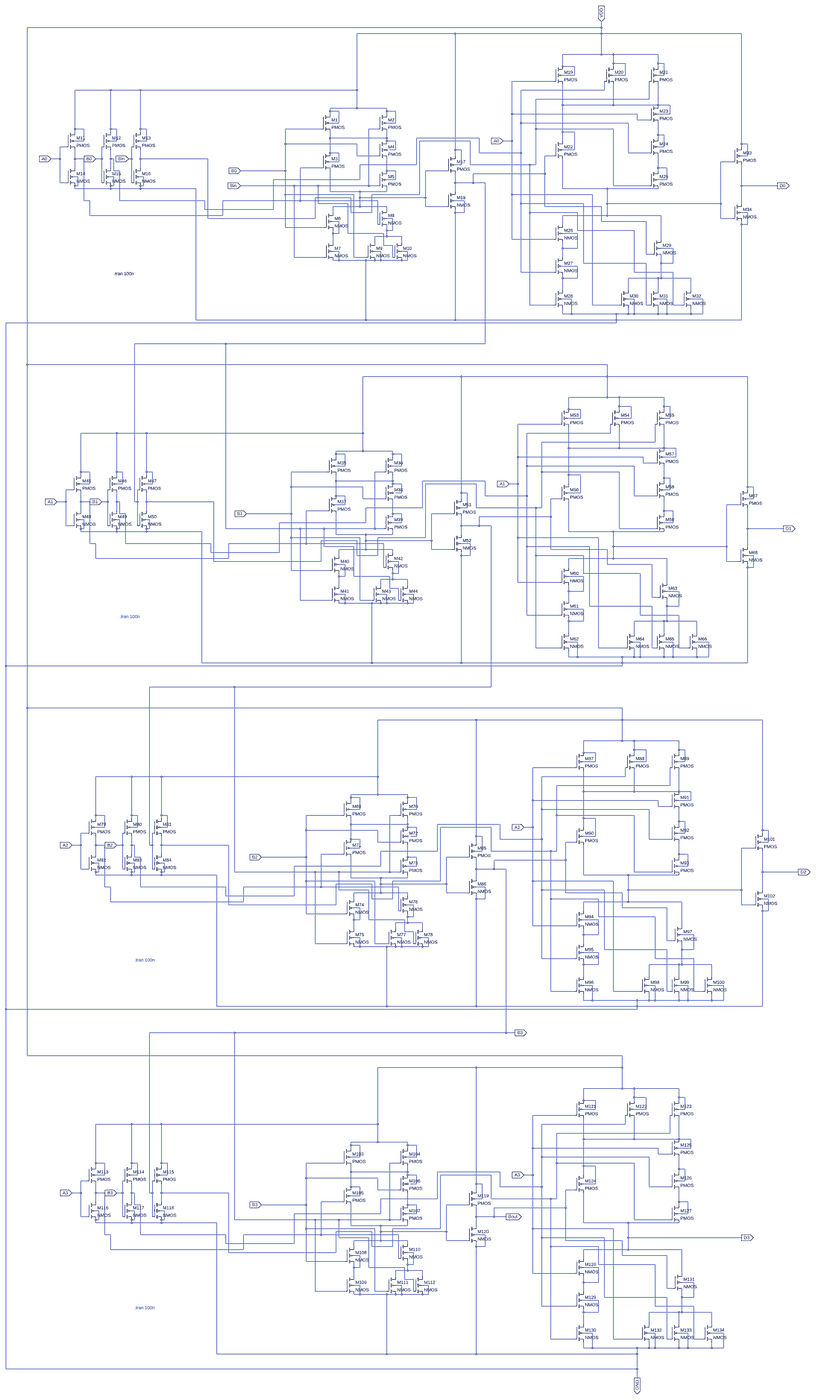
[diagram p0: schematic 4bit_Subtractor.asc, whole sheet]
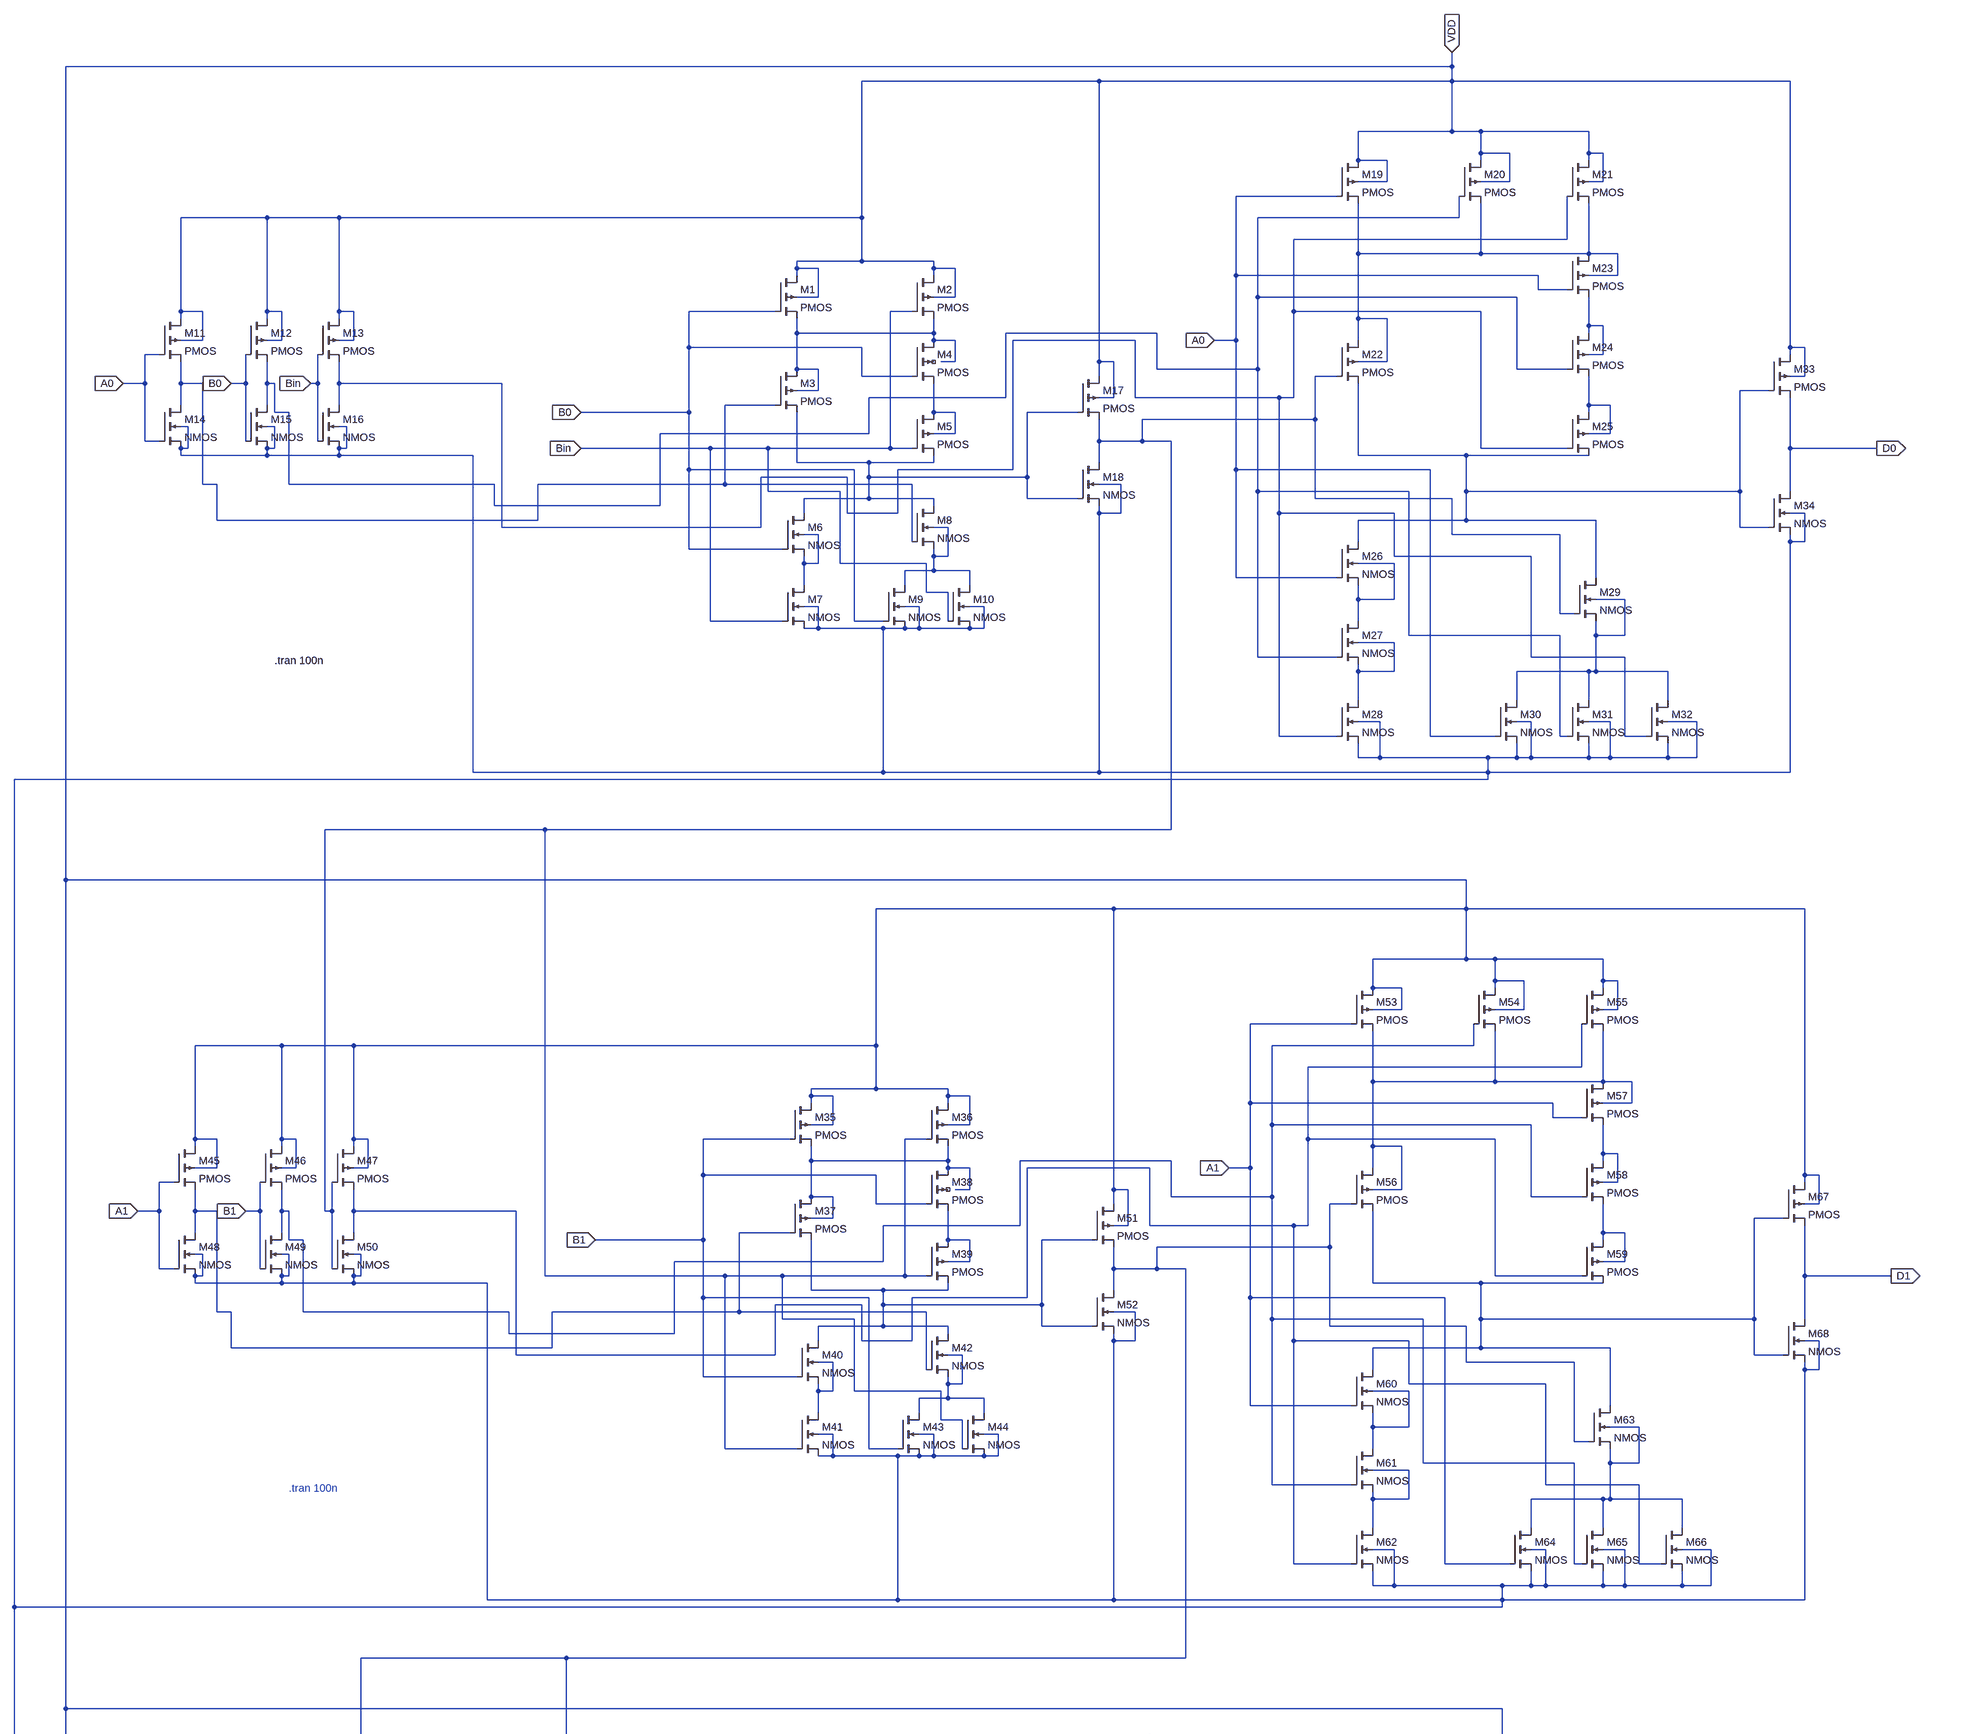
[diagram p1: schematic 4bit_Subtractor.asc, part, row 1 of 2, column 1 of 1]
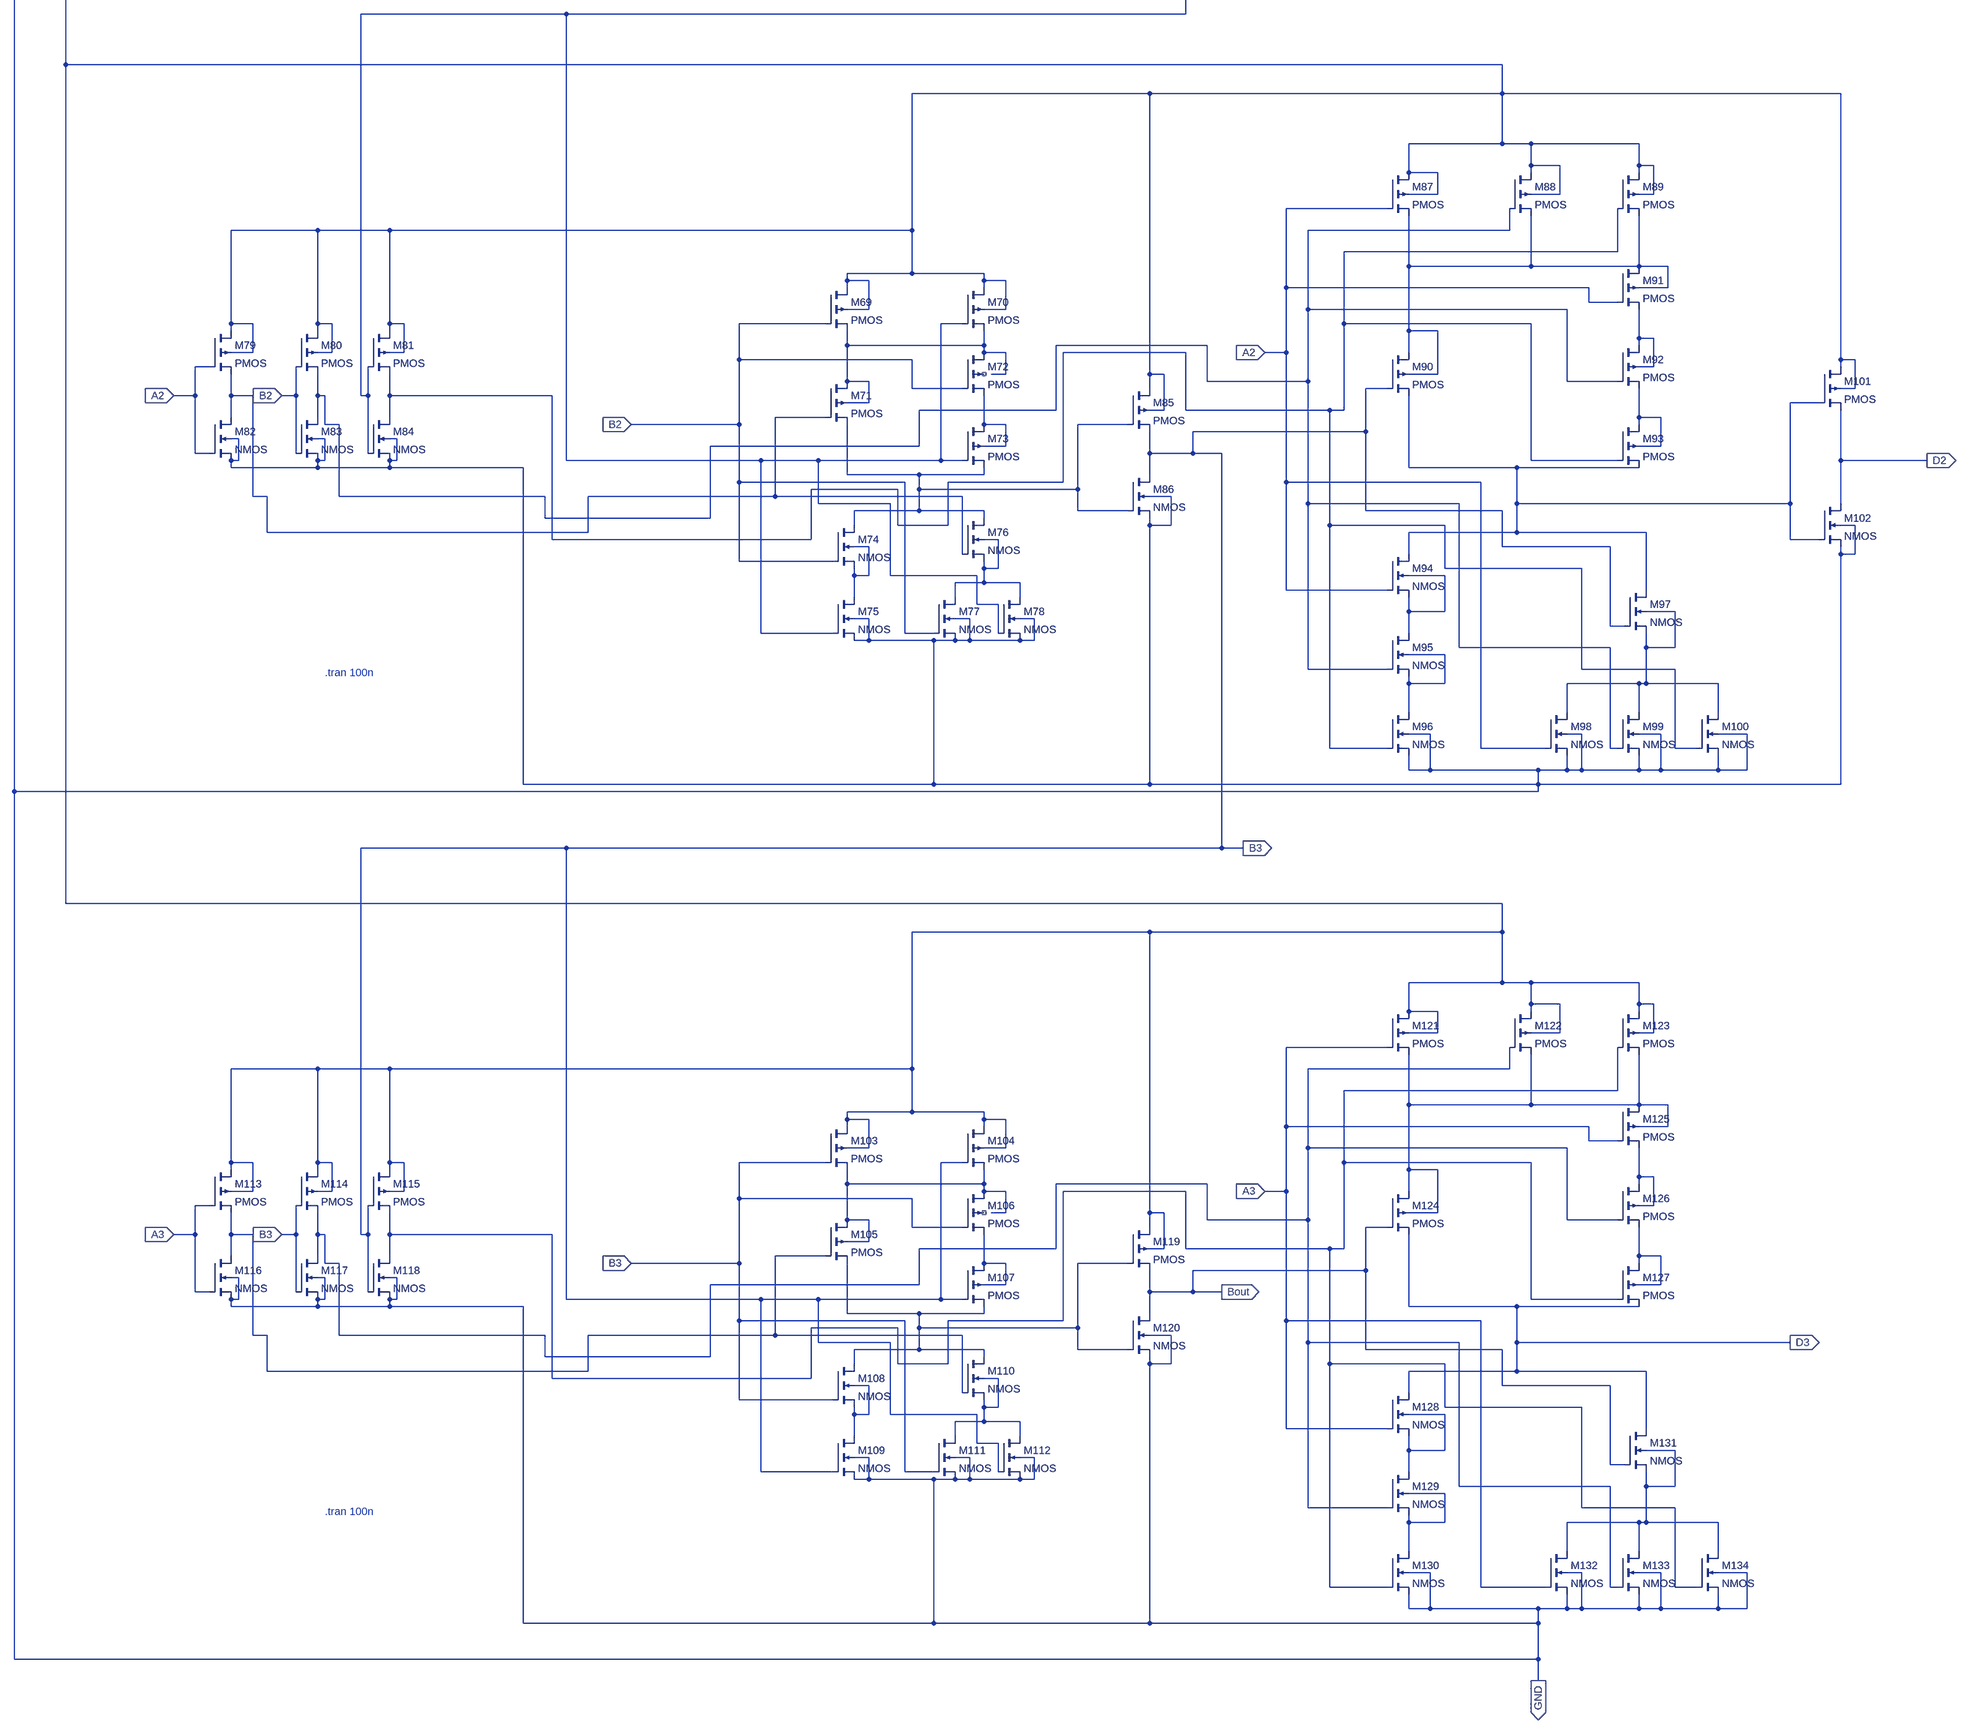
[diagram p2: schematic 4bit_Subtractor.asc, part, row 2 of 2, column 1 of 1]
4bit_Subtractor.asc, the LTspice schematic file:
Version 4.1
SHEET 1 3332 7932
WIRE 2096 -1616 2096 -1648
WIRE 2096 -1616 -1040 -1616
WIRE 1312 -1584 784 -1584
WIRE 2096 -1584 2096 -1616
WIRE 2096 -1584 1312 -1584
WIRE 2848 -1584 2096 -1584
WIRE 2096 -1472 2096 -1584
WIRE 2096 -1472 1888 -1472
WIRE 2160 -1472 2096 -1472
WIRE 2400 -1472 2160 -1472
WIRE 2160 -1424 2160 -1472
WIRE 2224 -1424 2160 -1424
WIRE 2400 -1424 2400 -1472
WIRE 2432 -1424 2400 -1424
WIRE 1888 -1408 1888 -1472
WIRE 1952 -1408 1888 -1408
WIRE 2160 -1408 2160 -1424
WIRE 2400 -1408 2400 -1424
WIRE 1952 -1360 1952 -1408
WIRE 1952 -1360 1888 -1360
WIRE 2224 -1360 2224 -1424
WIRE 2224 -1360 2160 -1360
WIRE 2432 -1360 2432 -1424
WIRE 2432 -1360 2400 -1360
WIRE 1840 -1328 1616 -1328
WIRE -592 -1280 -784 -1280
WIRE -432 -1280 -592 -1280
WIRE 784 -1280 784 -1584
WIRE 784 -1280 -432 -1280
WIRE 2112 -1280 2112 -1328
WIRE 2112 -1280 1664 -1280
WIRE 2352 -1232 2352 -1328
WIRE 2352 -1232 1744 -1232
WIRE 1888 -1200 1888 -1312
WIRE 2160 -1200 2160 -1312
WIRE 2160 -1200 1888 -1200
WIRE 2400 -1200 2400 -1312
WIRE 2400 -1200 2160 -1200
WIRE 2464 -1200 2400 -1200
WIRE 784 -1184 784 -1280
WIRE 784 -1184 640 -1184
WIRE 944 -1184 784 -1184
WIRE 640 -1168 640 -1184
WIRE 688 -1168 640 -1168
WIRE 944 -1168 944 -1184
WIRE 992 -1168 944 -1168
WIRE 640 -1152 640 -1168
WIRE 944 -1152 944 -1168
WIRE 1616 -1152 1616 -1328
WIRE 2288 -1152 1616 -1152
WIRE 2464 -1152 2464 -1200
WIRE 2464 -1152 2400 -1152
WIRE 2288 -1120 2288 -1152
WIRE 2352 -1120 2288 -1120
WIRE 688 -1104 688 -1168
WIRE 688 -1104 640 -1104
WIRE 992 -1104 992 -1168
WIRE 992 -1104 944 -1104
WIRE 1664 -1104 1664 -1280
WIRE 2240 -1104 1664 -1104
WIRE -784 -1072 -784 -1280
WIRE -736 -1072 -784 -1072
WIRE -592 -1072 -592 -1280
WIRE -560 -1072 -592 -1072
WIRE -432 -1072 -432 -1280
WIRE -400 -1072 -432 -1072
WIRE 592 -1072 400 -1072
WIRE 896 -1072 848 -1072
WIRE 1744 -1072 1744 -1232
WIRE 2160 -1072 1744 -1072
WIRE -784 -1056 -784 -1072
WIRE -592 -1056 -592 -1072
WIRE -432 -1056 -432 -1072
WIRE 1888 -1056 1888 -1200
WIRE 1952 -1056 1888 -1056
WIRE 2400 -1040 2400 -1104
WIRE 2432 -1040 2400 -1040
WIRE 640 -1024 640 -1056
WIRE 944 -1024 944 -1056
WIRE 944 -1024 640 -1024
WIRE 1440 -1024 1104 -1024
WIRE 2400 -1024 2400 -1040
WIRE -736 -1008 -736 -1072
WIRE -736 -1008 -784 -1008
WIRE -560 -1008 -560 -1072
WIRE -560 -1008 -592 -1008
WIRE -400 -1008 -400 -1072
WIRE -400 -1008 -432 -1008
WIRE 944 -1008 944 -1024
WIRE 992 -1008 944 -1008
WIRE 1392 -1008 1120 -1008
WIRE 1616 -1008 1616 -1152
WIRE 1616 -1008 1568 -1008
WIRE 1888 -1008 1888 -1056
WIRE 400 -992 400 -1072
WIRE 784 -992 400 -992
WIRE 2848 -992 2848 -1584
WIRE 2880 -992 2848 -992
WIRE -832 -976 -864 -976
WIRE 2432 -976 2432 -1040
WIRE 2432 -976 2400 -976
WIRE 2848 -976 2848 -992
WIRE 992 -960 992 -1008
WIRE 992 -960 960 -960
WIRE 1312 -960 1312 -1584
WIRE 1344 -960 1312 -960
WIRE 1952 -960 1952 -1056
WIRE 1952 -960 1888 -960
WIRE 640 -944 640 -1024
WIRE 688 -944 640 -944
WIRE 1440 -944 1440 -1024
WIRE 1664 -944 1664 -1104
WIRE 1664 -944 1440 -944
WIRE 2240 -944 2240 -1104
WIRE 2352 -944 2240 -944
WIRE 784 -928 784 -992
WIRE 896 -928 784 -928
WIRE 1312 -928 1312 -960
WIRE 1840 -928 1792 -928
WIRE 2880 -928 2880 -992
WIRE 2880 -928 2848 -928
WIRE -864 -912 -864 -976
WIRE -864 -912 -912 -912
WIRE -784 -912 -784 -960
WIRE -736 -912 -784 -912
WIRE -640 -912 -640 -976
WIRE -640 -912 -672 -912
WIRE -592 -912 -592 -960
WIRE -576 -912 -592 -912
WIRE -480 -912 -480 -976
WIRE -480 -912 -496 -912
WIRE -432 -912 -432 -960
WIRE -16 -912 -432 -912
WIRE 688 -896 688 -944
WIRE 688 -896 640 -896
WIRE 2800 -896 2736 -896
WIRE 1104 -880 1104 -1024
WIRE 1104 -880 800 -880
WIRE 1344 -880 1344 -960
WIRE 1344 -880 1312 -880
WIRE 1392 -880 1392 -1008
WIRE 1712 -880 1392 -880
WIRE 1744 -880 1744 -1072
WIRE 1744 -880 1712 -880
WIRE -784 -864 -784 -912
WIRE -592 -864 -592 -912
WIRE -432 -864 -432 -912
WIRE 592 -864 480 -864
WIRE 2400 -864 2400 -928
WIRE 2448 -864 2400 -864
WIRE -576 -848 -576 -912
WIRE -544 -848 -576 -848
WIRE 400 -848 400 -992
WIRE 400 -848 160 -848
WIRE 944 -848 944 -912
WIRE 992 -848 944 -848
WIRE 1264 -848 1152 -848
WIRE 2400 -848 2400 -864
WIRE 1792 -832 1792 -928
WIRE 1792 -832 1408 -832
WIRE -768 -816 -784 -816
WIRE -576 -816 -592 -816
WIRE -416 -816 -432 -816
WIRE 800 -800 800 -880
WIRE 800 -800 336 -800
WIRE 992 -800 992 -848
WIRE 992 -800 944 -800
WIRE 2448 -800 2448 -864
WIRE 2448 -800 2400 -800
WIRE -864 -784 -864 -912
WIRE -832 -784 -864 -784
WIRE -640 -784 -640 -912
WIRE -480 -784 -480 -912
WIRE 1312 -784 1312 -832
WIRE 1408 -784 1408 -832
WIRE 1408 -784 1312 -784
WIRE 1472 -784 1408 -784
WIRE -768 -768 -768 -816
WIRE -768 -768 -784 -768
WIRE -576 -768 -576 -816
WIRE -576 -768 -592 -768
WIRE -416 -768 -416 -816
WIRE -416 -768 -432 -768
WIRE 448 -768 160 -768
WIRE 576 -768 448 -768
WIRE 848 -768 848 -1072
WIRE 848 -768 576 -768
WIRE 896 -768 848 -768
WIRE 2160 -768 2160 -1072
WIRE 2352 -768 2160 -768
WIRE 2848 -768 2848 -880
WIRE 3040 -768 2848 -768
WIRE -784 -752 -784 -768
WIRE -592 -752 -592 -768
WIRE -592 -752 -784 -752
WIRE -432 -752 -432 -768
WIRE -432 -752 -592 -752
WIRE -80 -752 -432 -752
WIRE 1888 -752 1888 -912
WIRE 2128 -752 1888 -752
WIRE 2400 -752 2128 -752
WIRE 640 -736 640 -848
WIRE 800 -736 640 -736
WIRE 944 -736 944 -752
WIRE 944 -736 800 -736
WIRE 1312 -736 1312 -784
WIRE 400 -720 400 -848
WIRE 768 -720 400 -720
WIRE 1120 -720 1120 -1008
WIRE 1120 -720 864 -720
WIRE 1616 -720 1616 -1008
WIRE 2048 -720 1616 -720
WIRE 752 -704 560 -704
WIRE 800 -704 800 -736
WIRE 1152 -704 1152 -848
WIRE 1152 -704 800 -704
WIRE -736 -688 -736 -912
WIRE -704 -688 -736 -688
WIRE -544 -688 -544 -848
WIRE -32 -688 -544 -688
WIRE 480 -688 480 -864
WIRE 480 -688 64 -688
WIRE 896 -688 480 -688
WIRE 1360 -688 1312 -688
WIRE 576 -672 576 -768
WIRE 736 -672 576 -672
WIRE 1664 -672 1664 -944
WIRE 2000 -672 1664 -672
WIRE 2128 -672 2128 -752
WIRE 2736 -672 2736 -896
WIRE 2736 -672 2128 -672
WIRE 2848 -672 2848 -768
WIRE 800 -656 800 -704
WIRE 800 -656 656 -656
WIRE 944 -656 800 -656
WIRE 1152 -656 1152 -704
WIRE 1264 -656 1152 -656
WIRE 1792 -656 1792 -832
WIRE 2096 -656 1792 -656
WIRE -32 -640 -32 -688
WIRE 336 -640 336 -800
WIRE 336 -640 -32 -640
WIRE 944 -640 944 -656
WIRE 656 -624 656 -656
WIRE 752 -624 752 -704
WIRE 864 -624 864 -720
WIRE 864 -624 752 -624
WIRE 1312 -624 1312 -640
WIRE 1360 -624 1360 -688
WIRE 1360 -624 1312 -624
WIRE 1712 -624 1712 -880
WIRE 1968 -624 1712 -624
WIRE 2880 -624 2848 -624
WIRE -704 -608 -704 -688
WIRE 64 -608 64 -688
WIRE 64 -608 -704 -608
WIRE 2128 -608 2128 -672
WIRE 2128 -608 1888 -608
WIRE 2416 -608 2128 -608
WIRE -16 -592 -16 -912
WIRE 560 -592 560 -704
WIRE 560 -592 -16 -592
WIRE 976 -592 944 -592
WIRE 2736 -592 2736 -672
WIRE 2800 -592 2736 -592
WIRE 688 -576 656 -576
WIRE 2096 -576 2096 -656
WIRE 2336 -576 2096 -576
WIRE 896 -560 896 -688
WIRE 1888 -560 1888 -608
WIRE 2848 -560 2848 -576
WIRE 2880 -560 2880 -624
WIRE 2880 -560 2848 -560
WIRE 400 -544 400 -720
WIRE 608 -544 400 -544
WIRE 944 -528 944 -544
WIRE 976 -528 976 -592
WIRE 976 -528 944 -528
WIRE 1968 -528 1968 -624
WIRE 2272 -528 1968 -528
WIRE 656 -512 656 -528
WIRE 688 -512 688 -576
WIRE 688 -512 656 -512
WIRE 736 -512 736 -672
WIRE 928 -512 736 -512
WIRE 1968 -512 1888 -512
WIRE 944 -496 944 -528
WIRE 944 -496 880 -496
WIRE 1024 -496 944 -496
WIRE 1616 -480 1616 -720
WIRE 1840 -480 1616 -480
WIRE 2416 -480 2416 -608
WIRE 656 -464 656 -512
WIRE 880 -464 880 -496
WIRE 1024 -464 1024 -496
WIRE 928 -448 928 -512
WIRE 976 -448 928 -448
WIRE 1888 -432 1888 -464
WIRE 1968 -432 1968 -512
WIRE 1968 -432 1888 -432
WIRE 2480 -432 2416 -432
WIRE 688 -416 656 -416
WIRE 912 -416 880 -416
WIRE 1056 -416 1024 -416
WIRE 2336 -400 2336 -576
WIRE 2368 -400 2336 -400
WIRE 448 -384 448 -768
WIRE 608 -384 448 -384
WIRE 768 -384 768 -720
WIRE 832 -384 768 -384
WIRE 976 -384 976 -448
WIRE 1888 -384 1888 -432
WIRE 688 -368 688 -416
WIRE 688 -368 656 -368
WIRE 832 -368 688 -368
WIRE 880 -368 832 -368
WIRE 912 -368 912 -416
WIRE 912 -368 880 -368
WIRE 1024 -368 912 -368
WIRE 1056 -368 1056 -416
WIRE 1056 -368 1024 -368
WIRE 2000 -352 2000 -672
WIRE 2336 -352 2000 -352
WIRE 2416 -352 2416 -384
WIRE 2480 -352 2480 -432
WIRE 2480 -352 2416 -352
WIRE 1968 -336 1888 -336
WIRE 1664 -304 1664 -672
WIRE 1840 -304 1664 -304
WIRE 2272 -304 2272 -528
WIRE 2480 -304 2272 -304
WIRE 1888 -272 1888 -288
WIRE 1968 -272 1968 -336
WIRE 1968 -272 1888 -272
WIRE 2400 -272 2240 -272
WIRE 2416 -272 2416 -352
WIRE 2416 -272 2400 -272
WIRE 2576 -272 2416 -272
WIRE 1888 -208 1888 -272
WIRE 2240 -208 2240 -272
WIRE 2400 -208 2400 -272
WIRE 2576 -208 2576 -272
WIRE 1936 -160 1888 -160
WIRE 2272 -160 2240 -160
WIRE 2448 -160 2400 -160
WIRE 2640 -160 2576 -160
WIRE 1712 -128 1712 -624
WIRE 1840 -128 1712 -128
WIRE 2048 -128 2048 -720
WIRE 2192 -128 2048 -128
WIRE 2336 -128 2336 -352
WIRE 2352 -128 2336 -128
WIRE 2480 -128 2480 -304
WIRE 2528 -128 2480 -128
WIRE 1888 -80 1888 -112
WIRE 1936 -80 1936 -160
WIRE 1936 -80 1888 -80
WIRE 2176 -80 1936 -80
WIRE 2240 -80 2240 -112
WIRE 2240 -80 2176 -80
WIRE 2272 -80 2272 -160
WIRE 2272 -80 2240 -80
WIRE 2400 -80 2400 -112
WIRE 2400 -80 2272 -80
WIRE 2448 -80 2448 -160
WIRE 2448 -80 2400 -80
WIRE 2576 -80 2576 -112
WIRE 2576 -80 2448 -80
WIRE 2640 -80 2640 -160
WIRE 2640 -80 2576 -80
WIRE -80 -48 -80 -752
WIRE 832 -48 832 -368
WIRE 832 -48 -80 -48
WIRE 1312 -48 1312 -624
WIRE 1312 -48 832 -48
WIRE 2176 -48 2176 -80
WIRE 2176 -48 1312 -48
WIRE 2848 -48 2848 -560
WIRE 2848 -48 2176 -48
WIRE 2176 -32 2176 -48
WIRE 2176 -32 -1344 -32
WIRE 80 736 -464 736
WIRE 1472 736 1472 -784
WIRE 1472 736 80 736
WIRE -1040 848 -1040 -1616
WIRE 2128 848 -1040 848
WIRE 1344 912 816 912
WIRE 2128 912 2128 848
WIRE 2128 912 1344 912
WIRE 2880 912 2128 912
WIRE 2128 1024 2128 912
WIRE 2128 1024 1920 1024
WIRE 2192 1024 2128 1024
WIRE 2432 1024 2192 1024
WIRE 2192 1072 2192 1024
WIRE 2256 1072 2192 1072
WIRE 2432 1072 2432 1024
WIRE 2464 1072 2432 1072
WIRE 1920 1088 1920 1024
WIRE 1984 1088 1920 1088
WIRE 2192 1088 2192 1072
WIRE 2432 1088 2432 1072
WIRE 1984 1136 1984 1088
WIRE 1984 1136 1920 1136
WIRE 2256 1136 2256 1072
WIRE 2256 1136 2192 1136
WIRE 2464 1136 2464 1072
WIRE 2464 1136 2432 1136
WIRE 1872 1168 1648 1168
WIRE -560 1216 -752 1216
WIRE -400 1216 -560 1216
WIRE 816 1216 816 912
WIRE 816 1216 -400 1216
WIRE 2144 1216 2144 1168
WIRE 2144 1216 1696 1216
WIRE 2384 1264 2384 1168
WIRE 2384 1264 1776 1264
WIRE 1920 1296 1920 1184
WIRE 2192 1296 2192 1184
WIRE 2192 1296 1920 1296
WIRE 2432 1296 2432 1184
WIRE 2432 1296 2192 1296
WIRE 2496 1296 2432 1296
WIRE 816 1312 816 1216
WIRE 816 1312 672 1312
WIRE 976 1312 816 1312
WIRE 672 1328 672 1312
WIRE 720 1328 672 1328
WIRE 976 1328 976 1312
WIRE 1024 1328 976 1328
WIRE 672 1344 672 1328
WIRE 976 1344 976 1328
WIRE 1648 1344 1648 1168
WIRE 2320 1344 1648 1344
WIRE 2496 1344 2496 1296
WIRE 2496 1344 2432 1344
WIRE 2320 1376 2320 1344
WIRE 2384 1376 2320 1376
WIRE 720 1392 720 1328
WIRE 720 1392 672 1392
WIRE 1024 1392 1024 1328
WIRE 1024 1392 976 1392
WIRE 1696 1392 1696 1216
WIRE 2272 1392 1696 1392
WIRE -752 1424 -752 1216
WIRE -704 1424 -752 1424
WIRE -560 1424 -560 1216
WIRE -528 1424 -560 1424
WIRE -400 1424 -400 1216
WIRE -368 1424 -400 1424
WIRE 624 1424 432 1424
WIRE 928 1424 880 1424
WIRE 1776 1424 1776 1264
WIRE 2192 1424 1776 1424
WIRE -752 1440 -752 1424
WIRE -560 1440 -560 1424
WIRE -400 1440 -400 1424
WIRE 1920 1440 1920 1296
WIRE 1984 1440 1920 1440
WIRE 2432 1456 2432 1392
WIRE 2464 1456 2432 1456
WIRE 672 1472 672 1440
WIRE 976 1472 976 1440
WIRE 976 1472 672 1472
WIRE 1472 1472 1136 1472
WIRE 2432 1472 2432 1456
WIRE -704 1488 -704 1424
WIRE -704 1488 -752 1488
WIRE -528 1488 -528 1424
WIRE -528 1488 -560 1488
WIRE -368 1488 -368 1424
WIRE -368 1488 -400 1488
WIRE 976 1488 976 1472
WIRE 1024 1488 976 1488
WIRE 1424 1488 1152 1488
WIRE 1648 1488 1648 1344
WIRE 1648 1488 1600 1488
WIRE 1920 1488 1920 1440
WIRE 432 1504 432 1424
WIRE 816 1504 432 1504
WIRE 2880 1504 2880 912
WIRE 2912 1504 2880 1504
WIRE -800 1520 -832 1520
WIRE 2464 1520 2464 1456
WIRE 2464 1520 2432 1520
WIRE 2880 1520 2880 1504
WIRE 1024 1536 1024 1488
WIRE 1024 1536 992 1536
WIRE 1344 1536 1344 912
WIRE 1376 1536 1344 1536
WIRE 1984 1536 1984 1440
WIRE 1984 1536 1920 1536
WIRE 672 1552 672 1472
WIRE 720 1552 672 1552
WIRE 1472 1552 1472 1472
WIRE 1696 1552 1696 1392
WIRE 1696 1552 1472 1552
WIRE 2272 1552 2272 1392
WIRE 2384 1552 2272 1552
WIRE 816 1568 816 1504
WIRE 928 1568 816 1568
WIRE 1344 1568 1344 1536
WIRE 1872 1568 1824 1568
WIRE 2912 1568 2912 1504
WIRE 2912 1568 2880 1568
WIRE -832 1584 -832 1520
WIRE -832 1584 -880 1584
WIRE -752 1584 -752 1536
WIRE -704 1584 -752 1584
WIRE -608 1584 -608 1520
WIRE -608 1584 -640 1584
WIRE -560 1584 -560 1536
WIRE -544 1584 -560 1584
WIRE -464 1584 -464 736
WIRE -448 1584 -448 1520
WIRE -448 1584 -464 1584
WIRE -400 1584 -400 1536
WIRE 16 1584 -400 1584
WIRE 720 1600 720 1552
WIRE 720 1600 672 1600
WIRE 2832 1600 2768 1600
WIRE 1136 1616 1136 1472
WIRE 1136 1616 832 1616
WIRE 1376 1616 1376 1536
WIRE 1376 1616 1344 1616
WIRE 1424 1616 1424 1488
WIRE 1744 1616 1424 1616
WIRE 1776 1616 1776 1424
WIRE 1776 1616 1744 1616
WIRE -752 1632 -752 1584
WIRE -560 1632 -560 1584
WIRE -400 1632 -400 1584
WIRE 624 1632 512 1632
WIRE 2432 1632 2432 1568
WIRE 2480 1632 2432 1632
WIRE -544 1648 -544 1584
WIRE -512 1648 -544 1648
WIRE 432 1648 432 1504
WIRE 432 1648 192 1648
WIRE 976 1648 976 1584
WIRE 1024 1648 976 1648
WIRE 1296 1648 1184 1648
WIRE 2432 1648 2432 1632
WIRE 1824 1664 1824 1568
WIRE 1824 1664 1440 1664
WIRE -736 1680 -752 1680
WIRE -544 1680 -560 1680
WIRE -384 1680 -400 1680
WIRE 832 1696 832 1616
WIRE 832 1696 368 1696
WIRE 1024 1696 1024 1648
WIRE 1024 1696 976 1696
WIRE 2480 1696 2480 1632
WIRE 2480 1696 2432 1696
WIRE -832 1712 -832 1584
WIRE -800 1712 -832 1712
WIRE -608 1712 -608 1584
WIRE -448 1712 -448 1584
WIRE 1344 1712 1344 1664
WIRE 1440 1712 1440 1664
WIRE 1440 1712 1344 1712
WIRE 1504 1712 1440 1712
WIRE -736 1728 -736 1680
WIRE -736 1728 -752 1728
WIRE -544 1728 -544 1680
WIRE -544 1728 -560 1728
WIRE -384 1728 -384 1680
WIRE -384 1728 -400 1728
WIRE 80 1728 80 736
WIRE 480 1728 80 1728
WIRE 608 1728 480 1728
WIRE 880 1728 880 1424
WIRE 880 1728 608 1728
WIRE 928 1728 880 1728
WIRE 2192 1728 2192 1424
WIRE 2384 1728 2192 1728
WIRE 2880 1728 2880 1616
WIRE 3072 1728 2880 1728
WIRE -752 1744 -752 1728
WIRE -560 1744 -560 1728
WIRE -560 1744 -752 1744
WIRE -400 1744 -400 1728
WIRE -400 1744 -560 1744
WIRE -48 1744 -400 1744
WIRE 1920 1744 1920 1584
WIRE 2160 1744 1920 1744
WIRE 2432 1744 2160 1744
WIRE 672 1760 672 1648
WIRE 832 1760 672 1760
WIRE 976 1760 976 1744
WIRE 976 1760 832 1760
WIRE 1344 1760 1344 1712
WIRE 432 1776 432 1648
WIRE 800 1776 432 1776
WIRE 1152 1776 1152 1488
WIRE 1152 1776 896 1776
WIRE 1648 1776 1648 1488
WIRE 2080 1776 1648 1776
WIRE 784 1792 592 1792
WIRE 832 1792 832 1760
WIRE 1184 1792 1184 1648
WIRE 1184 1792 832 1792
WIRE -704 1808 -704 1584
WIRE -672 1808 -704 1808
WIRE -512 1808 -512 1648
WIRE 0 1808 -512 1808
WIRE 512 1808 512 1632
WIRE 512 1808 96 1808
WIRE 928 1808 512 1808
WIRE 1392 1808 1344 1808
WIRE 608 1824 608 1728
WIRE 768 1824 608 1824
WIRE 1696 1824 1696 1552
WIRE 2032 1824 1696 1824
WIRE 2160 1824 2160 1744
WIRE 2768 1824 2768 1600
WIRE 2768 1824 2160 1824
WIRE 2880 1824 2880 1728
WIRE 832 1840 832 1792
WIRE 832 1840 688 1840
WIRE 976 1840 832 1840
WIRE 1184 1840 1184 1792
WIRE 1296 1840 1184 1840
WIRE 1824 1840 1824 1664
WIRE 2128 1840 1824 1840
WIRE 0 1856 0 1808
WIRE 368 1856 368 1696
WIRE 368 1856 0 1856
WIRE 976 1856 976 1840
WIRE 688 1872 688 1840
WIRE 784 1872 784 1792
WIRE 896 1872 896 1776
WIRE 896 1872 784 1872
WIRE 1344 1872 1344 1856
WIRE 1392 1872 1392 1808
WIRE 1392 1872 1344 1872
WIRE 1744 1872 1744 1616
WIRE 2000 1872 1744 1872
WIRE 2912 1872 2880 1872
WIRE -672 1888 -672 1808
WIRE 96 1888 96 1808
WIRE 96 1888 -672 1888
WIRE 2160 1888 2160 1824
WIRE 2160 1888 1920 1888
WIRE 2448 1888 2160 1888
WIRE 16 1904 16 1584
WIRE 592 1904 592 1792
WIRE 592 1904 16 1904
WIRE 1008 1904 976 1904
WIRE 2768 1904 2768 1824
WIRE 2832 1904 2768 1904
WIRE 720 1920 688 1920
WIRE 2128 1920 2128 1840
WIRE 2368 1920 2128 1920
WIRE 928 1936 928 1808
WIRE 1920 1936 1920 1888
WIRE 2880 1936 2880 1920
WIRE 2912 1936 2912 1872
WIRE 2912 1936 2880 1936
WIRE 432 1952 432 1776
WIRE 640 1952 432 1952
WIRE 976 1968 976 1952
WIRE 1008 1968 1008 1904
WIRE 1008 1968 976 1968
WIRE 2000 1968 2000 1872
WIRE 2304 1968 2000 1968
WIRE 688 1984 688 1968
WIRE 720 1984 720 1920
WIRE 720 1984 688 1984
WIRE 768 1984 768 1824
WIRE 960 1984 768 1984
WIRE 2000 1984 1920 1984
WIRE 976 2000 976 1968
WIRE 976 2000 912 2000
WIRE 1056 2000 976 2000
WIRE 1648 2016 1648 1776
WIRE 1872 2016 1648 2016
WIRE 2448 2016 2448 1888
WIRE 688 2032 688 1984
WIRE 912 2032 912 2000
WIRE 1056 2032 1056 2000
WIRE 960 2048 960 1984
WIRE 1008 2048 960 2048
WIRE 1920 2064 1920 2032
WIRE 2000 2064 2000 1984
WIRE 2000 2064 1920 2064
WIRE 2512 2064 2448 2064
WIRE 720 2080 688 2080
WIRE 944 2080 912 2080
WIRE 1088 2080 1056 2080
WIRE 2368 2096 2368 1920
WIRE 2400 2096 2368 2096
WIRE 480 2112 480 1728
WIRE 640 2112 480 2112
WIRE 800 2112 800 1776
WIRE 864 2112 800 2112
WIRE 1008 2112 1008 2048
WIRE 1920 2112 1920 2064
WIRE 720 2128 720 2080
WIRE 720 2128 688 2128
WIRE 864 2128 720 2128
WIRE 912 2128 864 2128
WIRE 944 2128 944 2080
WIRE 944 2128 912 2128
WIRE 1056 2128 944 2128
WIRE 1088 2128 1088 2080
WIRE 1088 2128 1056 2128
WIRE 2032 2144 2032 1824
WIRE 2368 2144 2032 2144
WIRE 2448 2144 2448 2112
WIRE 2512 2144 2512 2064
WIRE 2512 2144 2448 2144
WIRE 2000 2160 1920 2160
WIRE 1696 2192 1696 1824
WIRE 1872 2192 1696 2192
WIRE 2304 2192 2304 1968
WIRE 2512 2192 2304 2192
WIRE 1920 2224 1920 2208
WIRE 2000 2224 2000 2160
WIRE 2000 2224 1920 2224
WIRE 2432 2224 2272 2224
WIRE 2448 2224 2448 2144
WIRE 2448 2224 2432 2224
WIRE 2608 2224 2448 2224
WIRE 1920 2288 1920 2224
WIRE 2272 2288 2272 2224
WIRE 2432 2288 2432 2224
WIRE 2608 2288 2608 2224
WIRE 1968 2336 1920 2336
WIRE 2304 2336 2272 2336
WIRE 2480 2336 2432 2336
WIRE 2672 2336 2608 2336
WIRE 1744 2368 1744 1872
WIRE 1872 2368 1744 2368
WIRE 2080 2368 2080 1776
WIRE 2224 2368 2080 2368
WIRE 2368 2368 2368 2144
WIRE 2384 2368 2368 2368
WIRE 2512 2368 2512 2192
WIRE 2560 2368 2512 2368
WIRE 1920 2416 1920 2384
WIRE 1968 2416 1968 2336
WIRE 1968 2416 1920 2416
WIRE 2208 2416 1968 2416
WIRE 2272 2416 2272 2384
WIRE 2272 2416 2208 2416
WIRE 2304 2416 2304 2336
WIRE 2304 2416 2272 2416
WIRE 2432 2416 2432 2384
WIRE 2432 2416 2304 2416
WIRE 2480 2416 2480 2336
WIRE 2480 2416 2432 2416
WIRE 2608 2416 2608 2384
WIRE 2608 2416 2480 2416
WIRE 2672 2416 2672 2336
WIRE 2672 2416 2608 2416
WIRE -48 2448 -48 1744
WIRE 864 2448 864 2128
WIRE 864 2448 -48 2448
WIRE 1344 2448 1344 1872
WIRE 1344 2448 864 2448
WIRE 2208 2448 2208 2416
WIRE 2208 2448 1344 2448
WIRE 2880 2448 2880 1936
WIRE 2880 2448 2208 2448
WIRE -1344 2464 -1344 -32
WIRE 2208 2464 2208 2448
WIRE 2208 2464 -1344 2464
WIRE 128 3104 -384 3104
WIRE 1504 3104 1504 1712
WIRE 1504 3104 128 3104
WIRE -1040 3248 -1040 848
WIRE 2208 3248 -1040 3248
WIRE 1424 3312 896 3312
WIRE 2208 3312 2208 3248
WIRE 2208 3312 1424 3312
WIRE 2960 3312 2208 3312
WIRE 2208 3424 2208 3312
WIRE 2208 3424 2000 3424
WIRE 2272 3424 2208 3424
WIRE 2512 3424 2272 3424
WIRE 2272 3472 2272 3424
WIRE 2336 3472 2272 3472
WIRE 2512 3472 2512 3424
WIRE 2544 3472 2512 3472
WIRE 2000 3488 2000 3424
WIRE 2064 3488 2000 3488
WIRE 2272 3488 2272 3472
WIRE 2512 3488 2512 3472
WIRE 2064 3536 2064 3488
WIRE 2064 3536 2000 3536
WIRE 2336 3536 2336 3472
WIRE 2336 3536 2272 3536
WIRE 2544 3536 2544 3472
WIRE 2544 3536 2512 3536
WIRE 1952 3568 1728 3568
WIRE -480 3616 -672 3616
WIRE -320 3616 -480 3616
WIRE 896 3616 896 3312
WIRE 896 3616 -320 3616
WIRE 2224 3616 2224 3568
WIRE 2224 3616 1776 3616
WIRE 2464 3664 2464 3568
WIRE 2464 3664 1856 3664
WIRE 2000 3696 2000 3584
WIRE 2272 3696 2272 3584
WIRE 2272 3696 2000 3696
WIRE 2512 3696 2512 3584
WIRE 2512 3696 2272 3696
WIRE 2576 3696 2512 3696
WIRE 896 3712 896 3616
WIRE 896 3712 752 3712
WIRE 1056 3712 896 3712
WIRE 752 3728 752 3712
WIRE 800 3728 752 3728
WIRE 1056 3728 1056 3712
WIRE 1104 3728 1056 3728
WIRE 752 3744 752 3728
WIRE 1056 3744 1056 3728
WIRE 1728 3744 1728 3568
WIRE 2400 3744 1728 3744
WIRE 2576 3744 2576 3696
WIRE 2576 3744 2512 3744
WIRE 2400 3776 2400 3744
WIRE 2464 3776 2400 3776
WIRE 800 3792 800 3728
WIRE 800 3792 752 3792
WIRE 1104 3792 1104 3728
WIRE 1104 3792 1056 3792
WIRE 1776 3792 1776 3616
WIRE 2352 3792 1776 3792
WIRE -672 3824 -672 3616
WIRE -624 3824 -672 3824
WIRE -480 3824 -480 3616
WIRE -448 3824 -480 3824
WIRE -320 3824 -320 3616
WIRE -288 3824 -320 3824
WIRE 704 3824 512 3824
WIRE 1008 3824 960 3824
WIRE 1856 3824 1856 3664
WIRE 2272 3824 1856 3824
WIRE -672 3840 -672 3824
WIRE -480 3840 -480 3824
WIRE -320 3840 -320 3824
WIRE 2000 3840 2000 3696
WIRE 2064 3840 2000 3840
WIRE 2512 3856 2512 3792
WIRE 2544 3856 2512 3856
WIRE 752 3872 752 3840
WIRE 1056 3872 1056 3840
WIRE 1056 3872 752 3872
WIRE 1552 3872 1216 3872
WIRE 2512 3872 2512 3856
WIRE -624 3888 -624 3824
WIRE -624 3888 -672 3888
WIRE -448 3888 -448 3824
WIRE -448 3888 -480 3888
WIRE -288 3888 -288 3824
WIRE -288 3888 -320 3888
WIRE 1056 3888 1056 3872
WIRE 1104 3888 1056 3888
WIRE 1504 3888 1232 3888
WIRE 1728 3888 1728 3744
WIRE 1728 3888 1680 3888
WIRE 2000 3888 2000 3840
WIRE 512 3904 512 3824
WIRE 896 3904 512 3904
WIRE 2960 3904 2960 3312
WIRE 2992 3904 2960 3904
WIRE -720 3920 -752 3920
WIRE 2544 3920 2544 3856
WIRE 2544 3920 2512 3920
WIRE 2960 3920 2960 3904
WIRE 1104 3936 1104 3888
WIRE 1104 3936 1072 3936
WIRE 1424 3936 1424 3312
WIRE 1456 3936 1424 3936
WIRE 2064 3936 2064 3840
WIRE 2064 3936 2000 3936
WIRE 752 3952 752 3872
WIRE 800 3952 752 3952
WIRE 1552 3952 1552 3872
WIRE 1776 3952 1776 3792
WIRE 1776 3952 1552 3952
WIRE 2352 3952 2352 3792
WIRE 2464 3952 2352 3952
WIRE 896 3968 896 3904
WIRE 1008 3968 896 3968
WIRE 1424 3968 1424 3936
WIRE 1952 3968 1904 3968
WIRE 2992 3968 2992 3904
WIRE 2992 3968 2960 3968
WIRE -752 3984 -752 3920
WIRE -752 3984 -800 3984
WIRE -672 3984 -672 3936
WIRE -624 3984 -672 3984
WIRE -528 3984 -528 3920
WIRE -528 3984 -560 3984
WIRE -480 3984 -480 3936
WIRE -464 3984 -480 3984
WIRE -384 3984 -384 3104
WIRE -368 3984 -368 3920
WIRE -368 3984 -384 3984
WIRE -320 3984 -320 3936
WIRE 96 3984 -320 3984
WIRE 800 4000 800 3952
WIRE 800 4000 752 4000
WIRE 2912 4000 2848 4000
WIRE 1216 4016 1216 3872
WIRE 1216 4016 912 4016
WIRE 1456 4016 1456 3936
WIRE 1456 4016 1424 4016
WIRE 1504 4016 1504 3888
WIRE 1824 4016 1504 4016
WIRE 1856 4016 1856 3824
WIRE 1856 4016 1824 4016
WIRE -672 4032 -672 3984
WIRE -480 4032 -480 3984
WIRE -320 4032 -320 3984
WIRE 704 4032 592 4032
WIRE 2512 4032 2512 3968
WIRE 2560 4032 2512 4032
WIRE -464 4048 -464 3984
WIRE -432 4048 -464 4048
WIRE 512 4048 512 3904
WIRE 512 4048 272 4048
WIRE 1056 4048 1056 3984
WIRE 1104 4048 1056 4048
WIRE 1376 4048 1264 4048
WIRE 2512 4048 2512 4032
WIRE 1904 4064 1904 3968
WIRE 1904 4064 1520 4064
WIRE -656 4080 -672 4080
WIRE -464 4080 -480 4080
WIRE -304 4080 -320 4080
WIRE 912 4096 912 4016
WIRE 912 4096 448 4096
WIRE 1104 4096 1104 4048
WIRE 1104 4096 1056 4096
WIRE 2560 4096 2560 4032
WIRE 2560 4096 2512 4096
WIRE -752 4112 -752 3984
WIRE -720 4112 -752 4112
WIRE -528 4112 -528 3984
WIRE -368 4112 -368 3984
WIRE 1424 4112 1424 4064
WIRE 1520 4112 1520 4064
WIRE 1520 4112 1424 4112
WIRE 1584 4112 1520 4112
WIRE -656 4128 -656 4080
WIRE -656 4128 -672 4128
WIRE -464 4128 -464 4080
WIRE -464 4128 -480 4128
WIRE -304 4128 -304 4080
WIRE -304 4128 -320 4128
WIRE 128 4128 128 3104
WIRE 560 4128 128 4128
WIRE 688 4128 560 4128
WIRE 960 4128 960 3824
WIRE 960 4128 688 4128
WIRE 1008 4128 960 4128
WIRE 2272 4128 2272 3824
WIRE 2464 4128 2272 4128
WIRE 2960 4128 2960 4016
WIRE 3152 4128 2960 4128
WIRE -672 4144 -672 4128
WIRE -480 4144 -480 4128
WIRE -480 4144 -672 4144
WIRE -320 4144 -320 4128
WIRE -320 4144 -480 4144
WIRE 32 4144 -320 4144
WIRE 2000 4144 2000 3984
WIRE 2240 4144 2000 4144
WIRE 2512 4144 2240 4144
WIRE 752 4160 752 4048
WIRE 912 4160 752 4160
WIRE 1056 4160 1056 4144
WIRE 1056 4160 912 4160
WIRE 1424 4160 1424 4112
WIRE 512 4176 512 4048
WIRE 880 4176 512 4176
WIRE 1232 4176 1232 3888
WIRE 1232 4176 976 4176
WIRE 1728 4176 1728 3888
WIRE 2160 4176 1728 4176
WIRE 864 4192 672 4192
WIRE 912 4192 912 4160
WIRE 1264 4192 1264 4048
WIRE 1264 4192 912 4192
WIRE -624 4208 -624 3984
WIRE -592 4208 -624 4208
WIRE -432 4208 -432 4048
WIRE 80 4208 -432 4208
WIRE 592 4208 592 4032
WIRE 592 4208 176 4208
WIRE 1008 4208 592 4208
WIRE 1472 4208 1424 4208
WIRE 688 4224 688 4128
WIRE 848 4224 688 4224
WIRE 1776 4224 1776 3952
WIRE 2112 4224 1776 4224
WIRE 2240 4224 2240 4144
WIRE 2848 4224 2848 4000
WIRE 2848 4224 2240 4224
WIRE 2960 4224 2960 4128
WIRE 912 4240 912 4192
WIRE 912 4240 768 4240
WIRE 1056 4240 912 4240
WIRE 1264 4240 1264 4192
WIRE 1376 4240 1264 4240
WIRE 1904 4240 1904 4064
WIRE 2208 4240 1904 4240
WIRE 80 4256 80 4208
WIRE 448 4256 448 4096
WIRE 448 4256 80 4256
WIRE 1056 4256 1056 4240
WIRE 768 4272 768 4240
WIRE 864 4272 864 4192
WIRE 976 4272 976 4176
WIRE 976 4272 864 4272
WIRE 1424 4272 1424 4256
WIRE 1472 4272 1472 4208
WIRE 1472 4272 1424 4272
WIRE 1824 4272 1824 4016
WIRE 2080 4272 1824 4272
WIRE 2992 4272 2960 4272
WIRE -592 4288 -592 4208
WIRE 176 4288 176 4208
WIRE 176 4288 -592 4288
WIRE 2240 4288 2240 4224
WIRE 2240 4288 2000 4288
WIRE 2528 4288 2240 4288
WIRE 96 4304 96 3984
WIRE 672 4304 672 4192
WIRE 672 4304 96 4304
WIRE 1088 4304 1056 4304
WIRE 2848 4304 2848 4224
WIRE 2912 4304 2848 4304
WIRE 800 4320 768 4320
WIRE 2208 4320 2208 4240
WIRE 2448 4320 2208 4320
WIRE 1008 4336 1008 4208
WIRE 2000 4336 2000 4288
WIRE 2960 4336 2960 4320
WIRE 2992 4336 2992 4272
WIRE 2992 4336 2960 4336
WIRE 512 4352 512 4176
WIRE 720 4352 512 4352
WIRE 1056 4368 1056 4352
WIRE 1088 4368 1088 4304
WIRE 1088 4368 1056 4368
WIRE 2080 4368 2080 4272
WIRE 2384 4368 2080 4368
WIRE 768 4384 768 4368
WIRE 800 4384 800 4320
WIRE 800 4384 768 4384
WIRE 848 4384 848 4224
WIRE 1040 4384 848 4384
WIRE 2080 4384 2000 4384
WIRE 1056 4400 1056 4368
WIRE 1056 4400 992 4400
WIRE 1136 4400 1056 4400
WIRE 1728 4416 1728 4176
WIRE 1952 4416 1728 4416
WIRE 2528 4416 2528 4288
WIRE 768 4432 768 4384
WIRE 992 4432 992 4400
WIRE 1136 4432 1136 4400
WIRE 1040 4448 1040 4384
WIRE 1088 4448 1040 4448
WIRE 2000 4464 2000 4432
WIRE 2080 4464 2080 4384
WIRE 2080 4464 2000 4464
WIRE 2592 4464 2528 4464
WIRE 800 4480 768 4480
WIRE 1024 4480 992 4480
WIRE 1168 4480 1136 4480
WIRE 2448 4496 2448 4320
WIRE 2480 4496 2448 4496
WIRE 560 4512 560 4128
WIRE 720 4512 560 4512
WIRE 880 4512 880 4176
WIRE 944 4512 880 4512
WIRE 1088 4512 1088 4448
WIRE 2000 4512 2000 4464
WIRE 800 4528 800 4480
WIRE 800 4528 768 4528
WIRE 944 4528 800 4528
WIRE 992 4528 944 4528
WIRE 1024 4528 1024 4480
WIRE 1024 4528 992 4528
WIRE 1136 4528 1024 4528
WIRE 1168 4528 1168 4480
WIRE 1168 4528 1136 4528
WIRE 2112 4544 2112 4224
WIRE 2448 4544 2112 4544
WIRE 2528 4544 2528 4512
WIRE 2592 4544 2592 4464
WIRE 2592 4544 2528 4544
WIRE 2080 4560 2000 4560
WIRE 1776 4592 1776 4224
WIRE 1952 4592 1776 4592
WIRE 2384 4592 2384 4368
WIRE 2592 4592 2384 4592
WIRE 2000 4624 2000 4608
WIRE 2080 4624 2080 4560
WIRE 2080 4624 2000 4624
WIRE 2512 4624 2352 4624
WIRE 2528 4624 2528 4544
WIRE 2528 4624 2512 4624
WIRE 2688 4624 2528 4624
WIRE 2000 4688 2000 4624
WIRE 2352 4688 2352 4624
WIRE 2512 4688 2512 4624
WIRE 2688 4688 2688 4624
WIRE 2048 4736 2000 4736
WIRE 2384 4736 2352 4736
WIRE 2560 4736 2512 4736
WIRE 2752 4736 2688 4736
WIRE 1824 4768 1824 4272
WIRE 1952 4768 1824 4768
WIRE 2160 4768 2160 4176
WIRE 2304 4768 2160 4768
WIRE 2448 4768 2448 4544
WIRE 2464 4768 2448 4768
WIRE 2592 4768 2592 4592
WIRE 2640 4768 2592 4768
WIRE 2000 4816 2000 4784
WIRE 2048 4816 2048 4736
WIRE 2048 4816 2000 4816
WIRE 2288 4816 2048 4816
WIRE 2352 4816 2352 4784
WIRE 2352 4816 2288 4816
WIRE 2384 4816 2384 4736
WIRE 2384 4816 2352 4816
WIRE 2512 4816 2512 4784
WIRE 2512 4816 2384 4816
WIRE 2560 4816 2560 4736
WIRE 2560 4816 2512 4816
WIRE 2688 4816 2688 4784
WIRE 2688 4816 2560 4816
WIRE 2752 4816 2752 4736
WIRE 2752 4816 2688 4816
WIRE 32 4848 32 4144
WIRE 944 4848 944 4528
WIRE 944 4848 32 4848
WIRE 1424 4848 1424 4272
WIRE 1424 4848 944 4848
WIRE 2288 4848 2288 4816
WIRE 2288 4848 1424 4848
WIRE 2960 4848 2960 4336
WIRE 2960 4848 2288 4848
WIRE -1344 4864 -1344 2464
WIRE 2288 4864 2288 4848
WIRE 2288 4864 -1344 4864
WIRE 128 5760 -384 5760
WIRE 1584 5760 1584 4112
WIRE 1584 5760 128 5760
WIRE 1632 5760 1584 5760
WIRE -1040 5936 -1040 3248
WIRE 2208 5936 -1040 5936
WIRE 1424 6000 896 6000
WIRE 2208 6000 2208 5936
WIRE 2208 6000 1424 6000
WIRE 2208 6112 2208 6000
WIRE 2208 6112 2000 6112
WIRE 2272 6112 2208 6112
WIRE 2512 6112 2272 6112
WIRE 2272 6160 2272 6112
WIRE 2336 6160 2272 6160
WIRE 2512 6160 2512 6112
WIRE 2544 6160 2512 6160
WIRE 2000 6176 2000 6112
WIRE 2064 6176 2000 6176
WIRE 2272 6176 2272 6160
WIRE 2512 6176 2512 6160
WIRE 2064 6224 2064 6176
WIRE 2064 6224 2000 6224
WIRE 2336 6224 2336 6160
WIRE 2336 6224 2272 6224
WIRE 2544 6224 2544 6160
WIRE 2544 6224 2512 6224
WIRE 1952 6256 1728 6256
WIRE -480 6304 -672 6304
WIRE -320 6304 -480 6304
WIRE 896 6304 896 6000
WIRE 896 6304 -320 6304
WIRE 2224 6304 2224 6256
WIRE 2224 6304 1776 6304
WIRE 2464 6352 2464 6256
WIRE 2464 6352 1856 6352
WIRE 2000 6384 2000 6272
WIRE 2272 6384 2272 6272
WIRE 2272 6384 2000 6384
WIRE 2512 6384 2512 6272
WIRE 2512 6384 2272 6384
WIRE 2576 6384 2512 6384
WIRE 896 6400 896 6304
WIRE 896 6400 752 6400
WIRE 1056 6400 896 6400
WIRE 752 6416 752 6400
WIRE 800 6416 752 6416
WIRE 1056 6416 1056 6400
WIRE 1104 6416 1056 6416
WIRE 752 6432 752 6416
WIRE 1056 6432 1056 6416
WIRE 1728 6432 1728 6256
WIRE 2400 6432 1728 6432
WIRE 2576 6432 2576 6384
WIRE 2576 6432 2512 6432
WIRE 2400 6464 2400 6432
WIRE 2464 6464 2400 6464
WIRE 800 6480 800 6416
WIRE 800 6480 752 6480
WIRE 1104 6480 1104 6416
WIRE 1104 6480 1056 6480
WIRE 1776 6480 1776 6304
WIRE 2352 6480 1776 6480
WIRE -672 6512 -672 6304
WIRE -624 6512 -672 6512
WIRE -480 6512 -480 6304
WIRE -448 6512 -480 6512
WIRE -320 6512 -320 6304
WIRE -288 6512 -320 6512
WIRE 704 6512 512 6512
WIRE 1008 6512 960 6512
WIRE 1856 6512 1856 6352
WIRE 2272 6512 1856 6512
WIRE -672 6528 -672 6512
WIRE -480 6528 -480 6512
WIRE -320 6528 -320 6512
WIRE 2000 6528 2000 6384
WIRE 2064 6528 2000 6528
WIRE 2512 6544 2512 6480
WIRE 2544 6544 2512 6544
WIRE 752 6560 752 6528
WIRE 1056 6560 1056 6528
WIRE 1056 6560 752 6560
WIRE 1552 6560 1216 6560
WIRE 2512 6560 2512 6544
WIRE -624 6576 -624 6512
WIRE -624 6576 -672 6576
WIRE -448 6576 -448 6512
WIRE -448 6576 -480 6576
WIRE -288 6576 -288 6512
WIRE -288 6576 -320 6576
WIRE 1056 6576 1056 6560
WIRE 1104 6576 1056 6576
WIRE 1504 6576 1232 6576
WIRE 1728 6576 1728 6432
WIRE 1728 6576 1680 6576
WIRE 2000 6576 2000 6528
WIRE 512 6592 512 6512
WIRE 896 6592 512 6592
WIRE -720 6608 -752 6608
WIRE 2544 6608 2544 6544
WIRE 2544 6608 2512 6608
WIRE 1104 6624 1104 6576
WIRE 1104 6624 1072 6624
WIRE 1424 6624 1424 6000
WIRE 1456 6624 1424 6624
WIRE 2064 6624 2064 6528
WIRE 2064 6624 2000 6624
WIRE 752 6640 752 6560
WIRE 800 6640 752 6640
WIRE 1552 6640 1552 6560
WIRE 1776 6640 1776 6480
WIRE 1776 6640 1552 6640
WIRE 2352 6640 2352 6480
WIRE 2464 6640 2352 6640
WIRE 896 6656 896 6592
WIRE 1008 6656 896 6656
WIRE 1424 6656 1424 6624
WIRE 1952 6656 1904 6656
WIRE -752 6672 -752 6608
WIRE -752 6672 -800 6672
WIRE -672 6672 -672 6624
WIRE -624 6672 -672 6672
WIRE -528 6672 -528 6608
WIRE -528 6672 -560 6672
WIRE -480 6672 -480 6624
WIRE -464 6672 -480 6672
WIRE -384 6672 -384 5760
WIRE -368 6672 -368 6608
WIRE -368 6672 -384 6672
WIRE -320 6672 -320 6624
WIRE 96 6672 -320 6672
WIRE 800 6688 800 6640
WIRE 800 6688 752 6688
WIRE 1216 6704 1216 6560
WIRE 1216 6704 912 6704
WIRE 1456 6704 1456 6624
WIRE 1456 6704 1424 6704
WIRE 1504 6704 1504 6576
WIRE 1824 6704 1504 6704
WIRE 1856 6704 1856 6512
WIRE 1856 6704 1824 6704
WIRE -672 6720 -672 6672
WIRE -480 6720 -480 6672
WIRE -320 6720 -320 6672
WIRE 704 6720 592 6720
WIRE 2512 6720 2512 6656
WIRE 2560 6720 2512 6720
WIRE -464 6736 -464 6672
WIRE -432 6736 -464 6736
WIRE 512 6736 512 6592
WIRE 512 6736 272 6736
WIRE 1056 6736 1056 6672
WIRE 1104 6736 1056 6736
WIRE 1376 6736 1264 6736
WIRE 2512 6736 2512 6720
WIRE 1904 6752 1904 6656
WIRE 1904 6752 1520 6752
WIRE -656 6768 -672 6768
WIRE -464 6768 -480 6768
WIRE -304 6768 -320 6768
WIRE 912 6784 912 6704
WIRE 912 6784 448 6784
WIRE 1104 6784 1104 6736
WIRE 1104 6784 1056 6784
WIRE 2560 6784 2560 6720
WIRE 2560 6784 2512 6784
WIRE -752 6800 -752 6672
WIRE -720 6800 -752 6800
WIRE -528 6800 -528 6672
WIRE -368 6800 -368 6672
WIRE 1424 6800 1424 6752
WIRE 1520 6800 1520 6752
WIRE 1520 6800 1424 6800
WIRE 1584 6800 1520 6800
WIRE -656 6816 -656 6768
WIRE -656 6816 -672 6816
WIRE -464 6816 -464 6768
WIRE -464 6816 -480 6816
WIRE -304 6816 -304 6768
WIRE -304 6816 -320 6816
WIRE 128 6816 128 5760
WIRE 560 6816 128 6816
WIRE 688 6816 560 6816
WIRE 960 6816 960 6512
WIRE 960 6816 688 6816
WIRE 1008 6816 960 6816
WIRE 2272 6816 2272 6512
WIRE 2464 6816 2272 6816
WIRE -672 6832 -672 6816
WIRE -480 6832 -480 6816
WIRE -480 6832 -672 6832
WIRE -320 6832 -320 6816
WIRE -320 6832 -480 6832
WIRE 32 6832 -320 6832
WIRE 2000 6832 2000 6672
WIRE 2240 6832 2000 6832
WIRE 2512 6832 2240 6832
WIRE 752 6848 752 6736
WIRE 912 6848 752 6848
WIRE 1056 6848 1056 6832
WIRE 1056 6848 912 6848
WIRE 1424 6848 1424 6800
WIRE 512 6864 512 6736
WIRE 880 6864 512 6864
WIRE 1232 6864 1232 6576
WIRE 1232 6864 976 6864
WIRE 1728 6864 1728 6576
WIRE 2160 6864 1728 6864
WIRE 864 6880 672 6880
WIRE 912 6880 912 6848
WIRE 1264 6880 1264 6736
WIRE 1264 6880 912 6880
WIRE -624 6896 -624 6672
WIRE -592 6896 -624 6896
WIRE -432 6896 -432 6736
WIRE 80 6896 -432 6896
WIRE 592 6896 592 6720
WIRE 592 6896 176 6896
WIRE 1008 6896 592 6896
WIRE 1472 6896 1424 6896
WIRE 688 6912 688 6816
WIRE 848 6912 688 6912
WIRE 1776 6912 1776 6640
WIRE 2112 6912 1776 6912
WIRE 2240 6912 2240 6832
WIRE 2848 6912 2240 6912
WIRE 912 6928 912 6880
WIRE 912 6928 768 6928
WIRE 1056 6928 912 6928
WIRE 1264 6928 1264 6880
WIRE 1376 6928 1264 6928
WIRE 1904 6928 1904 6752
WIRE 2208 6928 1904 6928
WIRE 80 6944 80 6896
WIRE 448 6944 448 6784
WIRE 448 6944 80 6944
WIRE 1056 6944 1056 6928
WIRE 768 6960 768 6928
WIRE 864 6960 864 6880
WIRE 976 6960 976 6864
WIRE 976 6960 864 6960
WIRE 1424 6960 1424 6944
WIRE 1472 6960 1472 6896
WIRE 1472 6960 1424 6960
WIRE 1824 6960 1824 6704
WIRE 2080 6960 1824 6960
WIRE -592 6976 -592 6896
WIRE 176 6976 176 6896
WIRE 176 6976 -592 6976
WIRE 2240 6976 2240 6912
WIRE 2240 6976 2000 6976
WIRE 2528 6976 2240 6976
WIRE 96 6992 96 6672
WIRE 672 6992 672 6880
WIRE 672 6992 96 6992
WIRE 1088 6992 1056 6992
WIRE 800 7008 768 7008
WIRE 2208 7008 2208 6928
WIRE 2448 7008 2208 7008
WIRE 1008 7024 1008 6896
WIRE 2000 7024 2000 6976
WIRE 512 7040 512 6864
WIRE 720 7040 512 7040
WIRE 1056 7056 1056 7040
WIRE 1088 7056 1088 6992
WIRE 1088 7056 1056 7056
WIRE 2080 7056 2080 6960
WIRE 2384 7056 2080 7056
WIRE 768 7072 768 7056
WIRE 800 7072 800 7008
WIRE 800 7072 768 7072
WIRE 848 7072 848 6912
WIRE 1040 7072 848 7072
WIRE 2080 7072 2000 7072
WIRE 1056 7088 1056 7056
WIRE 1056 7088 992 7088
WIRE 1136 7088 1056 7088
WIRE 1728 7104 1728 6864
WIRE 1952 7104 1728 7104
WIRE 2528 7104 2528 6976
WIRE 768 7120 768 7072
WIRE 992 7120 992 7088
WIRE 1136 7120 1136 7088
WIRE 1040 7136 1040 7072
WIRE 1088 7136 1040 7136
WIRE 2000 7152 2000 7120
WIRE 2080 7152 2080 7072
WIRE 2080 7152 2000 7152
WIRE 2592 7152 2528 7152
WIRE 800 7168 768 7168
WIRE 1024 7168 992 7168
WIRE 1168 7168 1136 7168
WIRE 2448 7184 2448 7008
WIRE 2480 7184 2448 7184
WIRE 560 7200 560 6816
WIRE 720 7200 560 7200
WIRE 880 7200 880 6864
WIRE 944 7200 880 7200
WIRE 1088 7200 1088 7136
WIRE 2000 7200 2000 7152
WIRE 800 7216 800 7168
WIRE 800 7216 768 7216
WIRE 944 7216 800 7216
WIRE 992 7216 944 7216
WIRE 1024 7216 1024 7168
WIRE 1024 7216 992 7216
WIRE 1136 7216 1024 7216
WIRE 1168 7216 1168 7168
WIRE 1168 7216 1136 7216
WIRE 2112 7232 2112 6912
WIRE 2448 7232 2112 7232
WIRE 2528 7232 2528 7200
WIRE 2592 7232 2592 7152
WIRE 2592 7232 2528 7232
WIRE 2080 7248 2000 7248
WIRE 1776 7280 1776 6912
WIRE 1952 7280 1776 7280
WIRE 2384 7280 2384 7056
WIRE 2592 7280 2384 7280
WIRE 2000 7312 2000 7296
WIRE 2080 7312 2080 7248
WIRE 2080 7312 2000 7312
WIRE 2512 7312 2352 7312
WIRE 2528 7312 2528 7232
WIRE 2528 7312 2512 7312
WIRE 2688 7312 2528 7312
WIRE 2000 7376 2000 7312
WIRE 2352 7376 2352 7312
WIRE 2512 7376 2512 7312
WIRE 2688 7376 2688 7312
WIRE 2048 7424 2000 7424
WIRE 2384 7424 2352 7424
WIRE 2560 7424 2512 7424
WIRE 2752 7424 2688 7424
WIRE 1824 7456 1824 6960
WIRE 1952 7456 1824 7456
WIRE 2160 7456 2160 6864
WIRE 2304 7456 2160 7456
WIRE 2448 7456 2448 7232
WIRE 2464 7456 2448 7456
WIRE 2592 7456 2592 7280
WIRE 2640 7456 2592 7456
WIRE 2000 7504 2000 7472
WIRE 2048 7504 2048 7424
WIRE 2048 7504 2000 7504
WIRE 2288 7504 2048 7504
WIRE 2352 7504 2352 7472
WIRE 2352 7504 2288 7504
WIRE 2384 7504 2384 7424
WIRE 2384 7504 2352 7504
WIRE 2512 7504 2512 7472
WIRE 2512 7504 2384 7504
WIRE 2560 7504 2560 7424
WIRE 2560 7504 2512 7504
WIRE 2688 7504 2688 7472
WIRE 2688 7504 2560 7504
WIRE 2752 7504 2752 7424
WIRE 2752 7504 2688 7504
WIRE 32 7536 32 6832
WIRE 944 7536 944 7216
WIRE 944 7536 32 7536
WIRE 1424 7536 1424 6960
WIRE 1424 7536 944 7536
WIRE 2288 7536 2288 7504
WIRE 2288 7536 1424 7536
WIRE -1344 7616 -1344 4864
WIRE 2288 7616 2288 7536
WIRE 2288 7616 -1344 7616
WIRE 2288 7664 2288 7616
FLAG -912 -912 A0
IOPIN -912 -912 In
FLAG -672 -912 B0
IOPIN -672 -912 In
FLAG -496 -912 Bin
IOPIN -496 -912 In
FLAG 2096 -1648 VDD
IOPIN 2096 -1648 In
FLAG 3040 -768 D0
IOPIN 3040 -768 Out
FLAG 160 -848 B0
IOPIN 160 -848 In
FLAG 160 -768 Bin
IOPIN 160 -768 In
FLAG 1568 -1008 A0
IOPIN 1568 -1008 In
FLAG -880 1584 A1
IOPIN -880 1584 In
FLAG -640 1584 B1
IOPIN -640 1584 In
FLAG 3072 1728 D1
IOPIN 3072 1728 Out
FLAG 192 1648 B1
IOPIN 192 1648 In
FLAG 1600 1488 A1
IOPIN 1600 1488 In
FLAG -800 3984 A2
IOPIN -800 3984 In
FLAG -560 3984 B2
IOPIN -560 3984 In
FLAG 3152 4128 D2
IOPIN 3152 4128 Out
FLAG 272 4048 B2
IOPIN 272 4048 In
FLAG 1680 3888 A2
IOPIN 1680 3888 In
FLAG -800 6672 A3
IOPIN -800 6672 In
FLAG -560 6672 B3
IOPIN -560 6672 In
FLAG 1584 6800 Bout
IOPIN 1584 6800 Out
FLAG 2848 6912 D3
IOPIN 2848 6912 Out
FLAG 272 6736 B3
IOPIN 272 6736 In
FLAG 1680 6576 A3
IOPIN 1680 6576 In
FLAG 2288 7664 GND
IOPIN 2288 7664 Out
FLAG 1632 5760 B3
IOPIN 1632 5760 Out
SYMBOL pmos4 592 -1152 R0
SYMATTR InstName M1
SYMBOL pmos4 896 -1152 R0
SYMATTR InstName M2
SYMBOL pmos4 592 -944 R0
SYMATTR InstName M3
SYMBOL pmos4 896 -1008 R0
SYMATTR InstName M4
SYMBOL pmos4 896 -848 R0
SYMATTR InstName M5
SYMBOL nmos4 608 -624 R0
SYMATTR InstName M6
SYMBOL nmos4 608 -464 R0
SYMATTR InstName M7
SYMBOL nmos4 896 -640 R0
SYMATTR InstName M8
SYMBOL nmos4 832 -464 R0
SYMATTR InstName M9
SYMBOL nmos4 976 -464 R0
SYMATTR InstName M10
SYMBOL pmos4 -832 -1056 R0
SYMATTR InstName M11
SYMBOL pmos4 -640 -1056 R0
SYMATTR InstName M12
SYMBOL pmos4 -480 -1056 R0
SYMATTR InstName M13
SYMBOL nmos4 -832 -864 R0
SYMATTR InstName M14
SYMBOL nmos4 -640 -864 R0
SYMATTR InstName M15
SYMBOL nmos4 -480 -864 R0
SYMATTR InstName M16
SYMBOL pmos4 1264 -928 R0
SYMATTR InstName M17
SYMBOL nmos4 1264 -736 R0
SYMATTR InstName M18
SYMBOL pmos4 1840 -1408 R0
SYMATTR InstName M19
SYMBOL pmos4 2112 -1408 R0
SYMATTR InstName M20
SYMBOL pmos4 2352 -1408 R0
SYMATTR InstName M21
SYMBOL pmos4 1840 -1008 R0
SYMATTR InstName M22
SYMBOL pmos4 2352 -1200 R0
SYMATTR InstName M23
SYMBOL pmos4 2352 -1024 R0
SYMATTR InstName M24
SYMBOL pmos4 2352 -848 R0
SYMATTR InstName M25
SYMBOL nmos4 1840 -560 R0
SYMATTR InstName M26
SYMBOL nmos4 1840 -384 R0
SYMATTR InstName M27
SYMBOL nmos4 1840 -208 R0
SYMATTR InstName M28
SYMBOL nmos4 2368 -480 R0
SYMATTR InstName M29
SYMBOL nmos4 2192 -208 R0
SYMATTR InstName M30
SYMBOL nmos4 2352 -208 R0
SYMATTR InstName M31
SYMBOL nmos4 2528 -208 R0
SYMATTR InstName M32
SYMBOL pmos4 2800 -976 R0
SYMATTR InstName M33
SYMBOL nmos4 2800 -672 R0
SYMATTR InstName M34
SYMBOL pmos4 624 1344 R0
SYMATTR InstName M35
SYMBOL pmos4 928 1344 R0
SYMATTR InstName M36
SYMBOL pmos4 624 1552 R0
SYMATTR InstName M37
SYMBOL pmos4 928 1488 R0
SYMATTR InstName M38
SYMBOL pmos4 928 1648 R0
SYMATTR InstName M39
SYMBOL nmos4 640 1872 R0
SYMATTR InstName M40
SYMBOL nmos4 640 2032 R0
SYMATTR InstName M41
SYMBOL nmos4 928 1856 R0
SYMATTR InstName M42
SYMBOL nmos4 864 2032 R0
SYMATTR InstName M43
SYMBOL nmos4 1008 2032 R0
SYMATTR InstName M44
SYMBOL pmos4 -800 1440 R0
SYMATTR InstName M45
SYMBOL pmos4 -608 1440 R0
SYMATTR InstName M46
SYMBOL pmos4 -448 1440 R0
SYMATTR InstName M47
SYMBOL nmos4 -800 1632 R0
SYMATTR InstName M48
SYMBOL nmos4 -608 1632 R0
SYMATTR InstName M49
SYMBOL nmos4 -448 1632 R0
SYMATTR InstName M50
SYMBOL pmos4 1296 1568 R0
SYMATTR InstName M51
SYMBOL nmos4 1296 1760 R0
SYMATTR InstName M52
SYMBOL pmos4 1872 1088 R0
SYMATTR InstName M53
SYMBOL pmos4 2144 1088 R0
SYMATTR InstName M54
SYMBOL pmos4 2384 1088 R0
SYMATTR InstName M55
SYMBOL pmos4 1872 1488 R0
SYMATTR InstName M56
SYMBOL pmos4 2384 1296 R0
SYMATTR InstName M57
SYMBOL pmos4 2384 1472 R0
SYMATTR InstName M58
SYMBOL pmos4 2384 1648 R0
SYMATTR InstName M59
SYMBOL nmos4 1872 1936 R0
SYMATTR InstName M60
SYMBOL nmos4 1872 2112 R0
SYMATTR InstName M61
SYMBOL nmos4 1872 2288 R0
SYMATTR InstName M62
SYMBOL nmos4 2400 2016 R0
SYMATTR InstName M63
SYMBOL nmos4 2224 2288 R0
SYMATTR InstName M64
SYMBOL nmos4 2384 2288 R0
SYMATTR InstName M65
SYMBOL nmos4 2560 2288 R0
SYMATTR InstName M66
SYMBOL pmos4 2832 1520 R0
SYMATTR InstName M67
SYMBOL nmos4 2832 1824 R0
SYMATTR InstName M68
SYMBOL pmos4 704 3744 R0
SYMATTR InstName M69
SYMBOL pmos4 1008 3744 R0
SYMATTR InstName M70
SYMBOL pmos4 704 3952 R0
SYMATTR InstName M71
SYMBOL pmos4 1008 3888 R0
SYMATTR InstName M72
SYMBOL pmos4 1008 4048 R0
SYMATTR InstName M73
SYMBOL nmos4 720 4272 R0
SYMATTR InstName M74
SYMBOL nmos4 720 4432 R0
SYMATTR InstName M75
SYMBOL nmos4 1008 4256 R0
SYMATTR InstName M76
SYMBOL nmos4 944 4432 R0
SYMATTR InstName M77
SYMBOL nmos4 1088 4432 R0
SYMATTR InstName M78
SYMBOL pmos4 -720 3840 R0
SYMATTR InstName M79
SYMBOL pmos4 -528 3840 R0
SYMATTR InstName M80
SYMBOL pmos4 -368 3840 R0
SYMATTR InstName M81
SYMBOL nmos4 -720 4032 R0
SYMATTR InstName M82
SYMBOL nmos4 -528 4032 R0
SYMATTR InstName M83
SYMBOL nmos4 -368 4032 R0
SYMATTR InstName M84
SYMBOL pmos4 1376 3968 R0
SYMATTR InstName M85
SYMBOL nmos4 1376 4160 R0
SYMATTR InstName M86
SYMBOL pmos4 1952 3488 R0
SYMATTR InstName M87
SYMBOL pmos4 2224 3488 R0
SYMATTR InstName M88
SYMBOL pmos4 2464 3488 R0
SYMATTR InstName M89
SYMBOL pmos4 1952 3888 R0
SYMATTR InstName M90
SYMBOL pmos4 2464 3696 R0
SYMATTR InstName M91
SYMBOL pmos4 2464 3872 R0
SYMATTR InstName M92
SYMBOL pmos4 2464 4048 R0
SYMATTR InstName M93
SYMBOL nmos4 1952 4336 R0
SYMATTR InstName M94
SYMBOL nmos4 1952 4512 R0
SYMATTR InstName M95
SYMBOL nmos4 1952 4688 R0
SYMATTR InstName M96
SYMBOL nmos4 2480 4416 R0
SYMATTR InstName M97
SYMBOL nmos4 2304 4688 R0
SYMATTR InstName M98
SYMBOL nmos4 2464 4688 R0
SYMATTR InstName M99
SYMBOL nmos4 2640 4688 R0
SYMATTR InstName M100
SYMBOL pmos4 2912 3920 R0
SYMATTR InstName M101
SYMBOL nmos4 2912 4224 R0
SYMATTR InstName M102
SYMBOL pmos4 704 6432 R0
SYMATTR InstName M103
SYMBOL pmos4 1008 6432 R0
SYMATTR InstName M104
SYMBOL pmos4 704 6640 R0
SYMATTR InstName M105
SYMBOL pmos4 1008 6576 R0
SYMATTR InstName M106
SYMBOL pmos4 1008 6736 R0
SYMATTR InstName M107
SYMBOL nmos4 720 6960 R0
SYMATTR InstName M108
SYMBOL nmos4 720 7120 R0
SYMATTR InstName M109
SYMBOL nmos4 1008 6944 R0
SYMATTR InstName M110
SYMBOL nmos4 944 7120 R0
SYMATTR InstName M111
SYMBOL nmos4 1088 7120 R0
SYMATTR InstName M112
SYMBOL pmos4 -720 6528 R0
SYMATTR InstName M113
SYMBOL pmos4 -528 6528 R0
SYMATTR InstName M114
SYMBOL pmos4 -368 6528 R0
SYMATTR InstName M115
SYMBOL nmos4 -720 6720 R0
SYMATTR InstName M116
SYMBOL nmos4 -528 6720 R0
SYMATTR InstName M117
SYMBOL nmos4 -368 6720 R0
SYMATTR InstName M118
SYMBOL pmos4 1376 6656 R0
SYMATTR InstName M119
SYMBOL nmos4 1376 6848 R0
SYMATTR InstName M120
SYMBOL pmos4 1952 6176 R0
SYMATTR InstName M121
SYMBOL pmos4 2224 6176 R0
SYMATTR InstName M122
SYMBOL pmos4 2464 6176 R0
SYMATTR InstName M123
SYMBOL pmos4 1952 6576 R0
SYMATTR InstName M124
SYMBOL pmos4 2464 6384 R0
SYMATTR InstName M125
SYMBOL pmos4 2464 6560 R0
SYMATTR InstName M126
SYMBOL pmos4 2464 6736 R0
SYMATTR InstName M127
SYMBOL nmos4 1952 7024 R0
SYMATTR InstName M128
SYMBOL nmos4 1952 7200 R0
SYMATTR InstName M129
SYMBOL nmos4 1952 7376 R0
SYMATTR InstName M130
SYMBOL nmos4 2480 7104 R0
SYMATTR InstName M131
SYMBOL nmos4 2304 7376 R0
SYMATTR InstName M132
SYMBOL nmos4 2464 7376 R0
SYMATTR InstName M133
SYMBOL nmos4 2640 7376 R0
SYMATTR InstName M134
TEXT -576 -296 Left 2 !.tran 100n
TEXT -544 2200 Left 2 ;.tran 100n
TEXT -464 4600 Left 2 ;.tran 100n
TEXT -464 7288 Left 2 ;.tran 100n

The netlist it stands for:
* 4bit_Subtractor.asc
M1 VDD B0 N005 VDD PMOS
M2 VDD Bin N005 VDD PMOS
M3 N005 N007 N011 N005 PMOS
M4 N005 B0 N010 NC_01 PMOS
M5 N010 Bin N011 N010 PMOS
M6 N011 B0 N013 N013 NMOS
M7 N013 Bin GND GND NMOS
M8 N011 N007 N012 N012 NMOS
M9 N012 B0 GND GND NMOS
M10 N012 Bin GND GND NMOS
M11 VDD A0 N007 VDD PMOS
M12 VDD B0 N001 VDD PMOS
M13 VDD Bin N002 VDD PMOS
M14 N007 A0 GND GND NMOS
M15 N001 B0 GND GND NMOS
M16 N002 Bin GND GND NMOS
M17 VDD N011 N006 VDD PMOS
M18 N006 N011 GND GND NMOS
M19 VDD A0 N003 VDD PMOS
M20 VDD N001 N003 VDD PMOS
M21 VDD N002 N003 VDD PMOS
M22 N003 N006 N008 N003 PMOS
M23 N003 A0 N004 N003 PMOS
M24 N004 N001 N009 N004 PMOS
M25 N009 N002 N008 N009 PMOS
M26 N008 A0 N014 N014 NMOS
M27 N014 N001 N016 N016 NMOS
M28 N016 N002 GND GND NMOS
M29 N008 N006 N015 N015 NMOS
M30 N015 A0 GND GND NMOS
M31 N015 N001 GND GND NMOS
M32 N015 N002 GND GND NMOS
M33 VDD N008 D0 VDD PMOS
M34 D0 N008 GND GND NMOS
M35 VDD B1 N021 VDD PMOS
M36 VDD N006 N021 VDD PMOS
M37 N021 N023 N027 N021 PMOS
M38 N021 B1 N026 NC_02 PMOS
M39 N026 N006 N027 N026 PMOS
M40 N027 B1 N029 N029 NMOS
M41 N029 N006 GND GND NMOS
M42 N027 N023 N028 N028 NMOS
M43 N028 B1 GND GND NMOS
M44 N028 N006 GND GND NMOS
M45 VDD A1 N023 VDD PMOS
M46 VDD B1 N017 VDD PMOS
M47 VDD N006 N018 VDD PMOS
M48 N023 A1 GND GND NMOS
M49 N017 B1 GND GND NMOS
M50 N018 N006 GND GND NMOS
M51 VDD N027 N022 VDD PMOS
M52 N022 N027 GND GND NMOS
M53 VDD A1 N019 VDD PMOS
M54 VDD N017 N019 VDD PMOS
M55 VDD N018 N019 VDD PMOS
M56 N019 N022 N024 N019 PMOS
M57 N019 A1 N020 N019 PMOS
M58 N020 N017 N025 N020 PMOS
M59 N025 N018 N024 N025 PMOS
M60 N024 A1 N030 N030 NMOS
M61 N030 N017 N032 N032 NMOS
M62 N032 N018 GND GND NMOS
M63 N024 N022 N031 N031 NMOS
M64 N031 A1 GND GND NMOS
M65 N031 N017 GND GND NMOS
M66 N031 N018 GND GND NMOS
M67 VDD N024 D1 VDD PMOS
M68 D1 N024 GND GND NMOS
M69 VDD B2 N037 VDD PMOS
M70 VDD N022 N037 VDD PMOS
M71 N037 N038 N042 N037 PMOS
M72 N037 B2 N041 NC_03 PMOS
M73 N041 N022 N042 N041 PMOS
M74 N042 B2 N044 N044 NMOS
M75 N044 N022 GND GND NMOS
M76 N042 N038 N043 N043 NMOS
M77 N043 B2 GND GND NMOS
M78 N043 N022 GND GND NMOS
M79 VDD A2 N038 VDD PMOS
M80 VDD B2 N033 VDD PMOS
M81 VDD N022 N034 VDD PMOS
M82 N038 A2 GND GND NMOS
M83 N033 B2 GND GND NMOS
M84 N034 N022 GND GND NMOS
M85 VDD N042 B3 VDD PMOS
M86 B3 N042 GND GND NMOS
M87 VDD A2 N035 VDD PMOS
M88 VDD N033 N035 VDD PMOS
M89 VDD N034 N035 VDD PMOS
M90 N035 B3 N039 N035 PMOS
M91 N035 A2 N036 N035 PMOS
M92 N036 N033 N040 N036 PMOS
M93 N040 N034 N039 N040 PMOS
M94 N039 A2 N045 N045 NMOS
M95 N045 N033 N047 N047 NMOS
M96 N047 N034 GND GND NMOS
M97 N039 B3 N046 N046 NMOS
M98 N046 A2 GND GND NMOS
M99 N046 N033 GND GND NMOS
M100 N046 N034 GND GND NMOS
M101 VDD N039 D2 VDD PMOS
M102 D2 N039 GND GND NMOS
M103 VDD B3 N052 VDD PMOS
M104 VDD B3 N052 VDD PMOS
M105 N052 N053 N056 N052 PMOS
M106 N052 B3 N055 NC_04 PMOS
M107 N055 B3 N056 N055 PMOS
M108 N056 B3 N058 N058 NMOS
M109 N058 B3 GND GND NMOS
M110 N056 N053 N057 N057 NMOS
M111 N057 B3 GND GND NMOS
M112 N057 B3 GND GND NMOS
M113 VDD A3 N053 VDD PMOS
M114 VDD B3 N048 VDD PMOS
M115 VDD B3 N049 VDD PMOS
M116 N053 A3 GND GND NMOS
M117 N048 B3 GND GND NMOS
M118 N049 B3 GND GND NMOS
M119 VDD N056 Bout VDD PMOS
M120 Bout N056 GND GND NMOS
M121 VDD A3 N050 VDD PMOS
M122 VDD N048 N050 VDD PMOS
M123 VDD N049 N050 VDD PMOS
M124 N050 Bout D3 N050 PMOS
M125 N050 A3 N051 N050 PMOS
M126 N051 N048 N054 N051 PMOS
M127 N054 N049 D3 N054 PMOS
M128 D3 A3 N059 N059 NMOS
M129 N059 N048 N061 N061 NMOS
M130 N061 N049 GND GND NMOS
M131 D3 Bout N060 N060 NMOS
M132 N060 A3 GND GND NMOS
M133 N060 N048 GND GND NMOS
M134 N060 N049 GND GND NMOS
.model NMOS NMOS
.model PMOS PMOS
.lib standard.mos
.tran 100n
* .tran 100n
* .tran 100n
* .tran 100n
.backanno
.end